# Altium project Power_vac.PrjPcb (part 1 of 2)
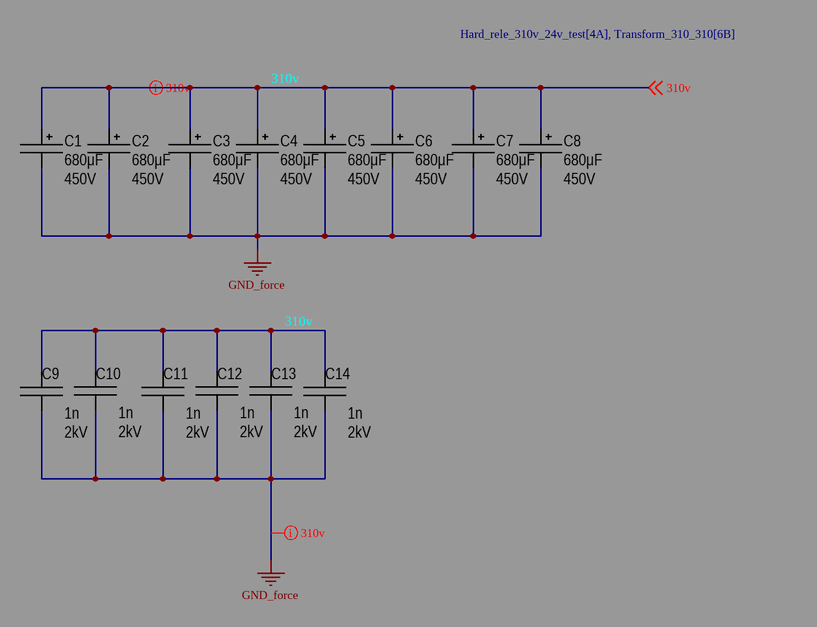
[diagram p0: Capasitors_vac.SchDoc]
9 sheets, 296 parts. Net scope: flat (ports and power ports of the same name join across sheets).
Board file: Power_vac.PcbDoc
Sheets:
  Capasitors_vac.SchDoc
  Hard_rele_310v_24v_test.SchDoc
  Cnnectors_power1.SchDoc
  Transform_12_310.SchDoc
  Transform_310_310.SchDoc
  Transform_310_3_24_24.SchDoc
  Detect_220.SchDoc
  Filtr_220.SchDoc
  Remove_from_CPU_to_Power.SchDoc

## Sheet Capasitors_vac.SchDoc
size A; SheetNumber: 1; SheetTotal: 9

### Parts
C1  value 680μF  Voltage: 450V  [CAP: D35C10H40]
C2  value 680μF  Voltage: 450V  [CAP: D35C10H40]
C3  value 680μF  Voltage: 450V  [CAP: D35C10H40]
C4  value 680μF  Voltage: 450V  [CAP: D35C10H40]
C5  value 680μF  Voltage: 450V  [CAP: D35C10H40]
C6  value 680μF  Voltage: 450V  [CAP: D35C10H40]
C7  value 680μF  Voltage: 450V  [CAP: D35C10H40]
C8  value 680μF  Voltage: 450V  [CAP: D35C10H40]
C9  value 1n  Voltage: 2kV  [CAP: AY2102M29Y5US63L7]
C10  value 1n  Voltage: 2kV  [CAP: AY2102M29Y5US63L7]
C11  value 1n  Voltage: 2kV  [CAP: AY2102M29Y5US63L7]
C12  value 1n  Voltage: 2kV  [CAP: AY2102M29Y5US63L7]
C13  value 1n  Voltage: 2kV  [CAP: AY2102M29Y5US63L7]
C14  value 1n  Voltage: 2kV  [CAP: AY2102M29Y5US63L7]

### Nets
GND_force: C1.2 C2.2 C3.2 C4.2 C5.2 C6.2 C7.2 C8.2 C9.2 C10.2 C11.2 C12.2 C13.2 C14.2
310v: C1.1 C2.1 C3.1 C4.1 C5.1 C6.1 C7.1 C8.1 C9.1 C10.1 C11.1 C12.1 C13.1 C14.1 ; off-sheet 310v

### Layout directives
net class 310v: 310v, GND_force

### Library data of the parts
C1-C8 = Aluminium: Manufacturer: Wurth; PartNumber: 860080475013; ValueManufacturerPartNumber: Aluminium capacitor, 680μF, 450V, ±20%, 54mOhm, 14x10x5 mm, -55...+105°C; TypeCapacitor: Aluminium capacitor; Tolerance: ±20%; Impedance: 54mOhm; Package: 14x10x5 mm; HelpURL: https://www.digikey.com/product-detail/en/wurth-electronics-inc/860080475013/732-9029-1-ND/5728972; Temperature: -55...+105°C
C9-C14 = Film: Manufacturer: Epcos; PartNumber: B32774D4106K000; ValueManufacturerPartNumber: Film capacitor, 1n, 2kV, ±10%, 10.9mOhm, 31.5x15 mm, -40...+105°C; TypeCapacitor: Film capacitor; Tolerance: ±10%; Impedance: 10.9mOhm; Package: 31.5x15 mm; HelpURL: https://www.digikey.com/products/en/capacitors/film-capacitors/62?k=&pkeyword=&sv=0&pv2097=1958&sf=0&FV=fffc01ef%2C1f140000%2Cffe0003e%2Cffec6366&quantity=1&ColumnSort=1000011&page=1&stock=1&pageSize=25; Temperature: -40...+105°C

## Sheet Hard_rele_310v_24v_test.SchDoc
size B; SheetNumber: 2; SheetTotal: 9
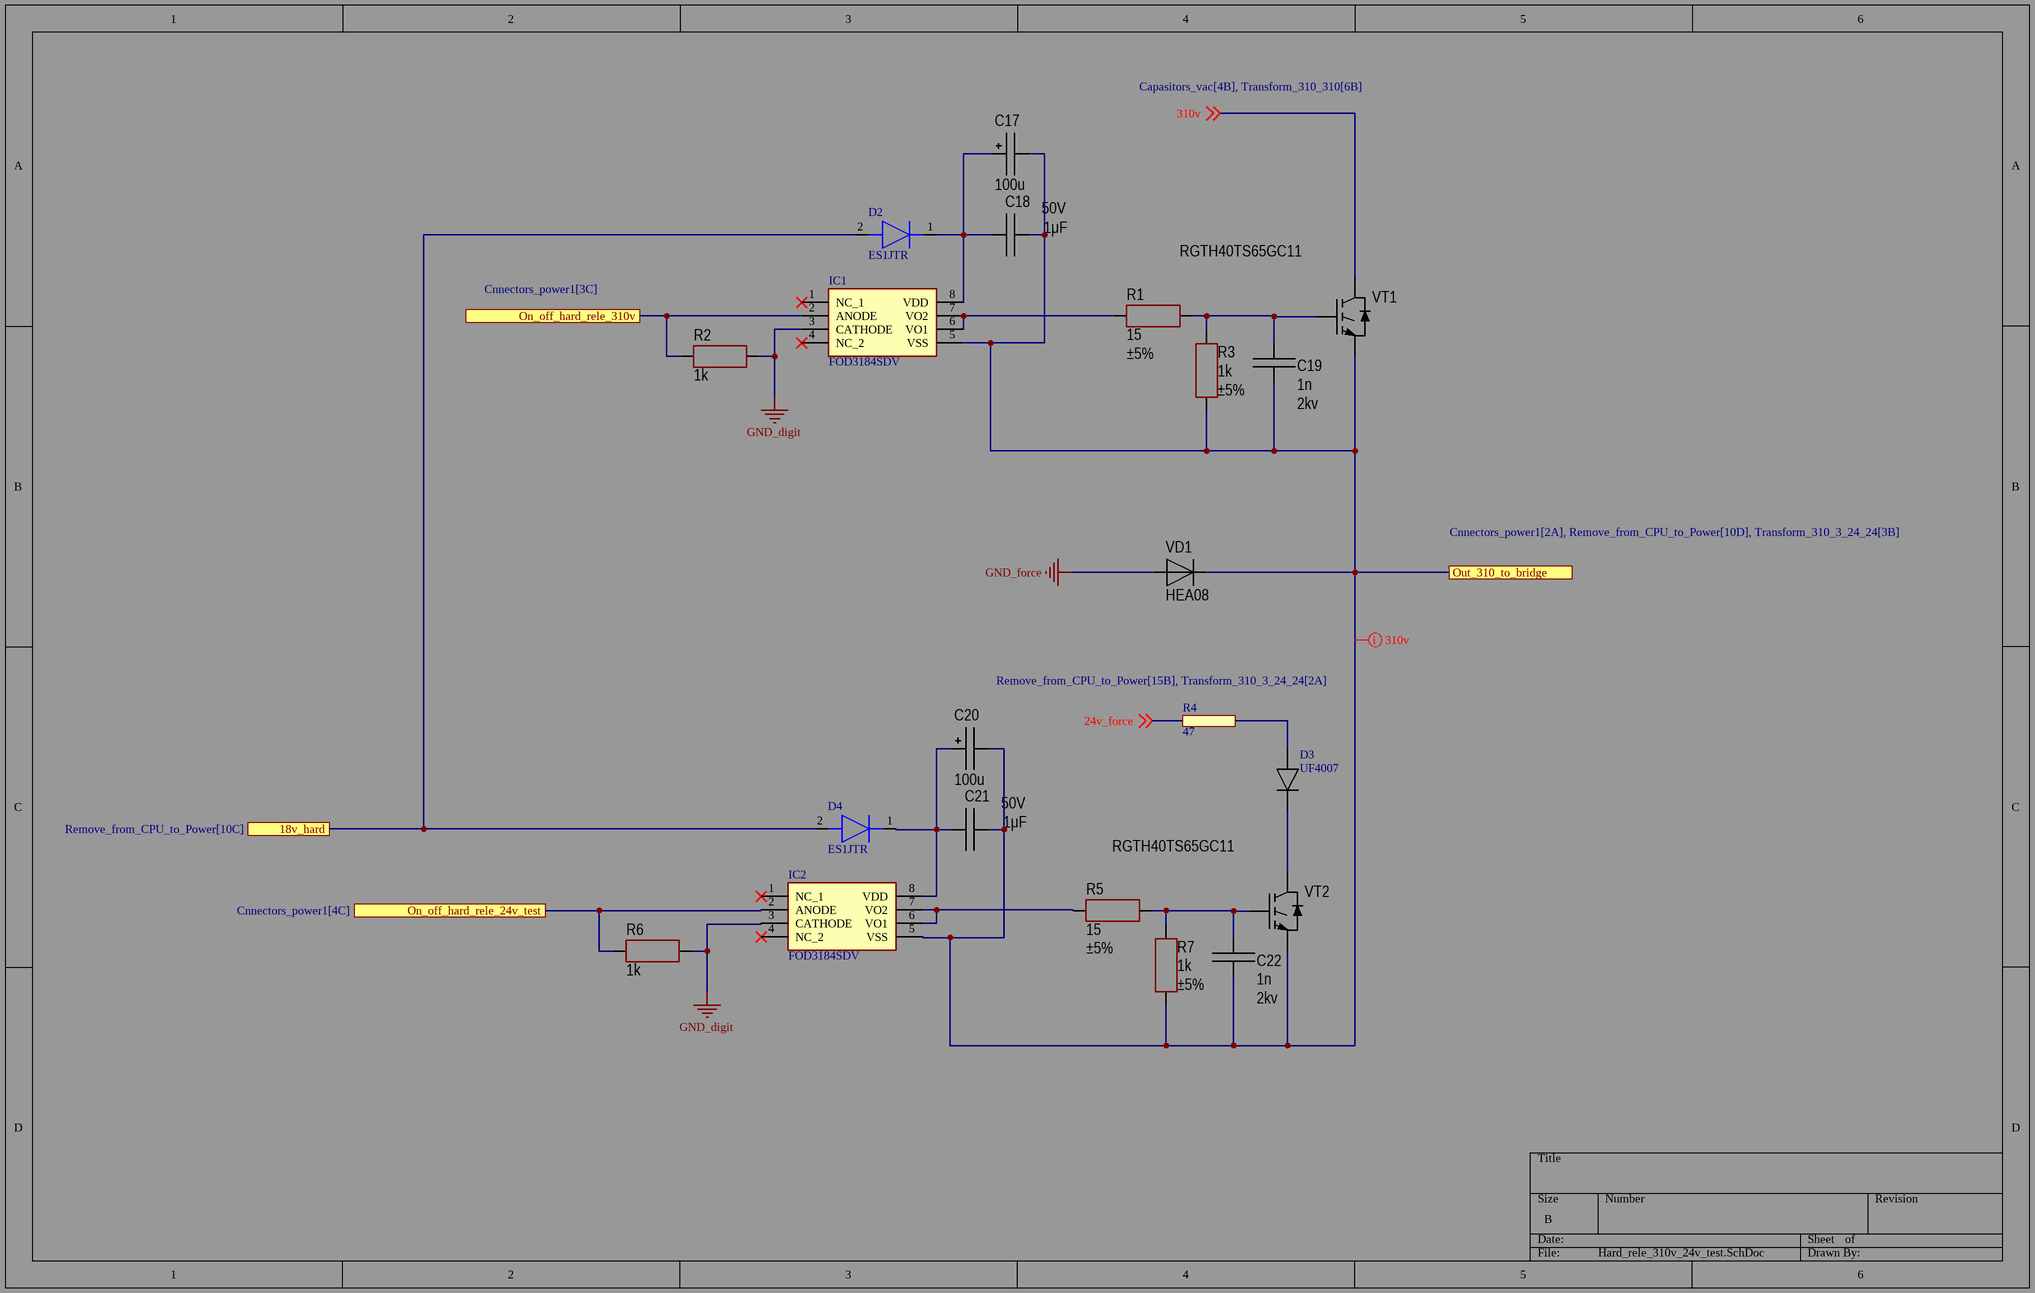
[diagram p1: Hard_rele_310v_24v_test.SchDoc]

### Parts
C17  value 100u  [CAP: D8C3.5H12]
C18  value 1μF  Voltage: 50V  [CAP: 1206]
C19  value 1n  Voltage: 2kv  [CAP: AY2102M29Y5US63L7]
C20  value 100u  [CAP: D8C3.5H12]
C21  value 1μF  Voltage: 50V  [CAP: 1206]
C22  value 1n  Voltage: 2kv  [CAP: AY2102M29Y5US63L7]
D2  ES1JTR  [DIOM5226X295N]
D3  UF4007  [THT_D_6mm_1]
D4  ES1JTR  [DIOM5226X295N]
IC1  FOD3184SDV  [SOP254P1030X508-8N]
IC2  FOD3184SDV  [SOP254P1030X508-8N]
R1  value 15  Tolerance: ±5%  [RES: 2512]
R2  value 1k  [RES: 1206]
R3  value 1k  Tolerance: ±5%  [RES: 2512]
R4  47  [THT_R_6mm_1]
R5  value 15  Tolerance: ±5%  [RES: 2512]
R6  value 1k  [RES: 1206]
R7  value 1k  Tolerance: ±5%  [RES: 2512]
VD1  PartNumber: HEA08  [TO247(D)]
VT1  PartNumber: RGTH40TS65GC11  [TO247]
VT2  PartNumber: RGTH40TS65GC11  [TO247]

### Ports
18v_hard (see Remove_from_CPU_to_Power[10C]), On_off_hard_rele_24v_test (see Cnnectors_power1[4C]), On_off_hard_rele_310v (see Cnnectors_power1[3C]), Out_310_to_bridge (see Cnnectors_power1[2A], Remove_from_CPU_to_Power[10D], Transform_310_3_24_24[3B])

### Nets
GND_digit: IC1.3(CATHODE) IC2.3(CATHODE) R2.1 R6.1
GND_force: VD1.1
18v_hard: D2.2(A) D4.2(A) ; port 18v_hard
24v_force: R4.1 ; off-sheet 24v_force
310v: VT1.2(C) ; off-sheet 310v
On_off_hard_rele_24v_test: IC2.2(ANODE) R6.2 ; port On_off_hard_rele_24v_test
On_off_hard_rele_310v: IC1.2(ANODE) R2.2 ; port On_off_hard_rele_310v
Out_310_to_bridge: C17.2 C18.1 C19.1 C20.2 C21.1 C22.1 IC1.5(VSS) IC2.5(VSS) R3.1 R7.1 VD1.2 VT1.3(E) VT2.3(E) ; port Out_310_to_bridge
NetC17_1: C17.1 C18.2 D2.1(K) IC1.8(VDD)
NetC19_2: C19.2 R1.1 R3.2 VT1.1(G)
NetC20_1: C20.1 C21.2 D4.1(K) IC2.8(VDD)
NetC22_2: C22.2 R5.1 R7.2 VT2.1(G)
NetD3_1: D3.1 R4.2
NetD3_2: D3.2 VT2.2(C)
NetIC1_6: IC1.6(VO1) IC1.7(VO2) R1.2
NetIC2_6: IC2.6(VO1) IC2.7(VO2) R5.2

Not connected (* = marked no-connect by the designer): IC1 1(NC_1)* 4(NC_2)*; IC2 1(NC_1)* 4(NC_2)*

### Layout directives
net class 310v: Out_310_to_bridge

### Library data of the parts
C17 C20 = Aluminium: Manufacturer: Wurth; PartNumber: 860080475013; ValueManufacturerPartNumber: Aluminium capacitor, 100u, 25V, ±20%, 54mOhm, 14x10x5 mm, -55...+105°C; TypeCapacitor: Aluminium capacitor; Tolerance: ±20%; Impedance: 54mOhm; Voltage: 25V; Package: 14x10x5 mm; HelpURL: https://www.digikey.com/product-detail/en/wurth-electronics-inc/860080475013/732-9029-1-ND/5728972; Temperature: -55...+105°C
C18 C21 = Ceramic_1206: Manufacturer: Yageo; PartNumber: CC1206KRX7R9BB104; ValueManufacturerPartNumber: Ceramic capacitor, 1μF, X7R, ±10%, 50V, 1206, -55...+125°C; TypeCapacitor: Ceramic capacitor; Tolerance: ±10%; TypeDielectric: X7R; Package: 1206; HelpURL: https://www.digikey.com/product-detail/en/yageo/CC1206KRX7R9BB104/311-1179-1-ND/303089; Temperature: -55...+125°C
C19 C22 = Film: Manufacturer: Epcos; PartNumber: B32774D4106K000; ValueManufacturerPartNumber: Film capacitor, 1n, 2kv, ±10%, 10.9mOhm, 31.5x15 mm, -40...+105°C; TypeCapacitor: Film capacitor; Tolerance: ±10%; Impedance: 10.9mOhm; Package: 31.5x15 mm; HelpURL: https://www.digikey.com/products/en/capacitors/film-capacitors/62?k=&pkeyword=&sv=0&pv2097=1958&sf=0&FV=fffc01ef%2C1f140000%2Cffe0003e%2Cffec6366&quantity=1&ColumnSort=1000011&page=1&stock=1&pageSize=25; Temperature: -40...+105°C
D2 D4 = ES1JTR: Diode; Manufacturer_Name: SMC Diode Solutions; Datasheet Link: http://www.smc-diodes.com/propdf/ES1(A-M)%20N0159%20REV.E.pdf; Height: 2.95mm; Manufacturer_Part_Number: ES1JTR
D3 = THT_D_6mm_1
IC1 IC2 = FOD3184SDV: Integrated Circuit; Manufacturer_Name: onsemi; Datasheet Link: https://www.arrow.com/en/products/fod3184sdv/on-semiconductor; Height: 5.08mm; Manufacturer_Part_Number: FOD3184SDV; Mouser Part Number: 512-FOD3184SDV; Mouser Price/Stock: https://www.mouser.co.uk/ProductDetail/onsemi-Fairchild/FOD3184SDV?qs=GCVmsggAYMRSO6%252BIR7fWEw%3D%3D; Arrow Part Number: FOD3184SDV; Arrow Price/Stock: https://www.arrow.com/en/products/fod3184sdv/on-semiconductor?region=nac
R1 R5 = Resistor_2512: Manufacturer: Yageo; PartNumber: RC2512JK-07100RL; ValueManufacturerPartNumber: Resistor film, 15, ±5%, 2512, 1W, -55...+125°C; TypeResistor: Resistor film; Power: 1W; Package: 2512; HelpURL: https://www.digikey.com/product-detail/en/yageo/RC2512JK-07100RL/YAG3393CT-ND/5962215; Temperature: -55...+125°C
R2 R6 = Resistor_1206: Manufacturer: Yageo; PartNumber: RC1206JR-07100RL; ValueManufacturerPartNumber: Resistor film, 1k, ±5%, 1206, 0.25W, -55...+125°C; TypeResistor: Resistor film; Power: 0.25W; Tolerance: ±5%; Package: 1206; HelpURL: https://www.digikey.com/product-detail/en/yageo/RC1206JR-07100RL/311-100ERCT-ND/732153; Temperature: -55...+125°C
R3 R7 = Resistor_2512: Manufacturer: Yageo; PartNumber: RC2512JK-07100RL; ValueManufacturerPartNumber: Resistor film, 1k, ±5%, 2512, 1W, -55...+125°C; TypeResistor: Resistor film; Power: 1W; Package: 2512; HelpURL: https://www.digikey.com/product-detail/en/yageo/RC2512JK-07100RL/YAG3393CT-ND/5962215; Temperature: -55...+125°C
R4 = THT_R_6mm_1
VD1 = Diode_single: Manufacturer: Micro Commercial; ValueManufacturerPartNumber: Single diode, 75V, 150mA, 1V, 4ns, SOD-323, -55...+150°C; TypeDiode: Single diode; Voltage: 75V; Current: 150mA; VoltageDrop: 1V; RecoveryTime: 4ns; Package: SOD-323; HelpURL: https://www.digikey.com/product-detail/en/micro-commercial-co/1N4148WX-TP/1N4148WXTPMSCT-ND/717312; Temperature: -55...+150°C
VT1 VT2 = IGBT: Manufacturer: Rohm Semiconductor; ValueManufacturerPartNumber: IGBT transistor, 650V, 40A, 40nC, 144W, 2.1V, 22ns/73ns, TO247, -55...+125°C; TypeTransistor: IGBT transistor; VoltageCE: 650V; CurrentCE: 40A; VoltageSaturation: 2.1V; GateCharge: 40nC; TimeOnOff: 22ns/73ns; MaxPower: 144W; Package: TO247; HelpURL: https://www.digikey.com/product-detail/en/rohm-semiconductor/RGTH40TS65GC11/RGTH40TS65GC11-ND/5029953; Temperature: -55...+125°C

## Sheet Cnnectors_power1.SchDoc
size C; SheetNumber: 3; SheetTotal: 9
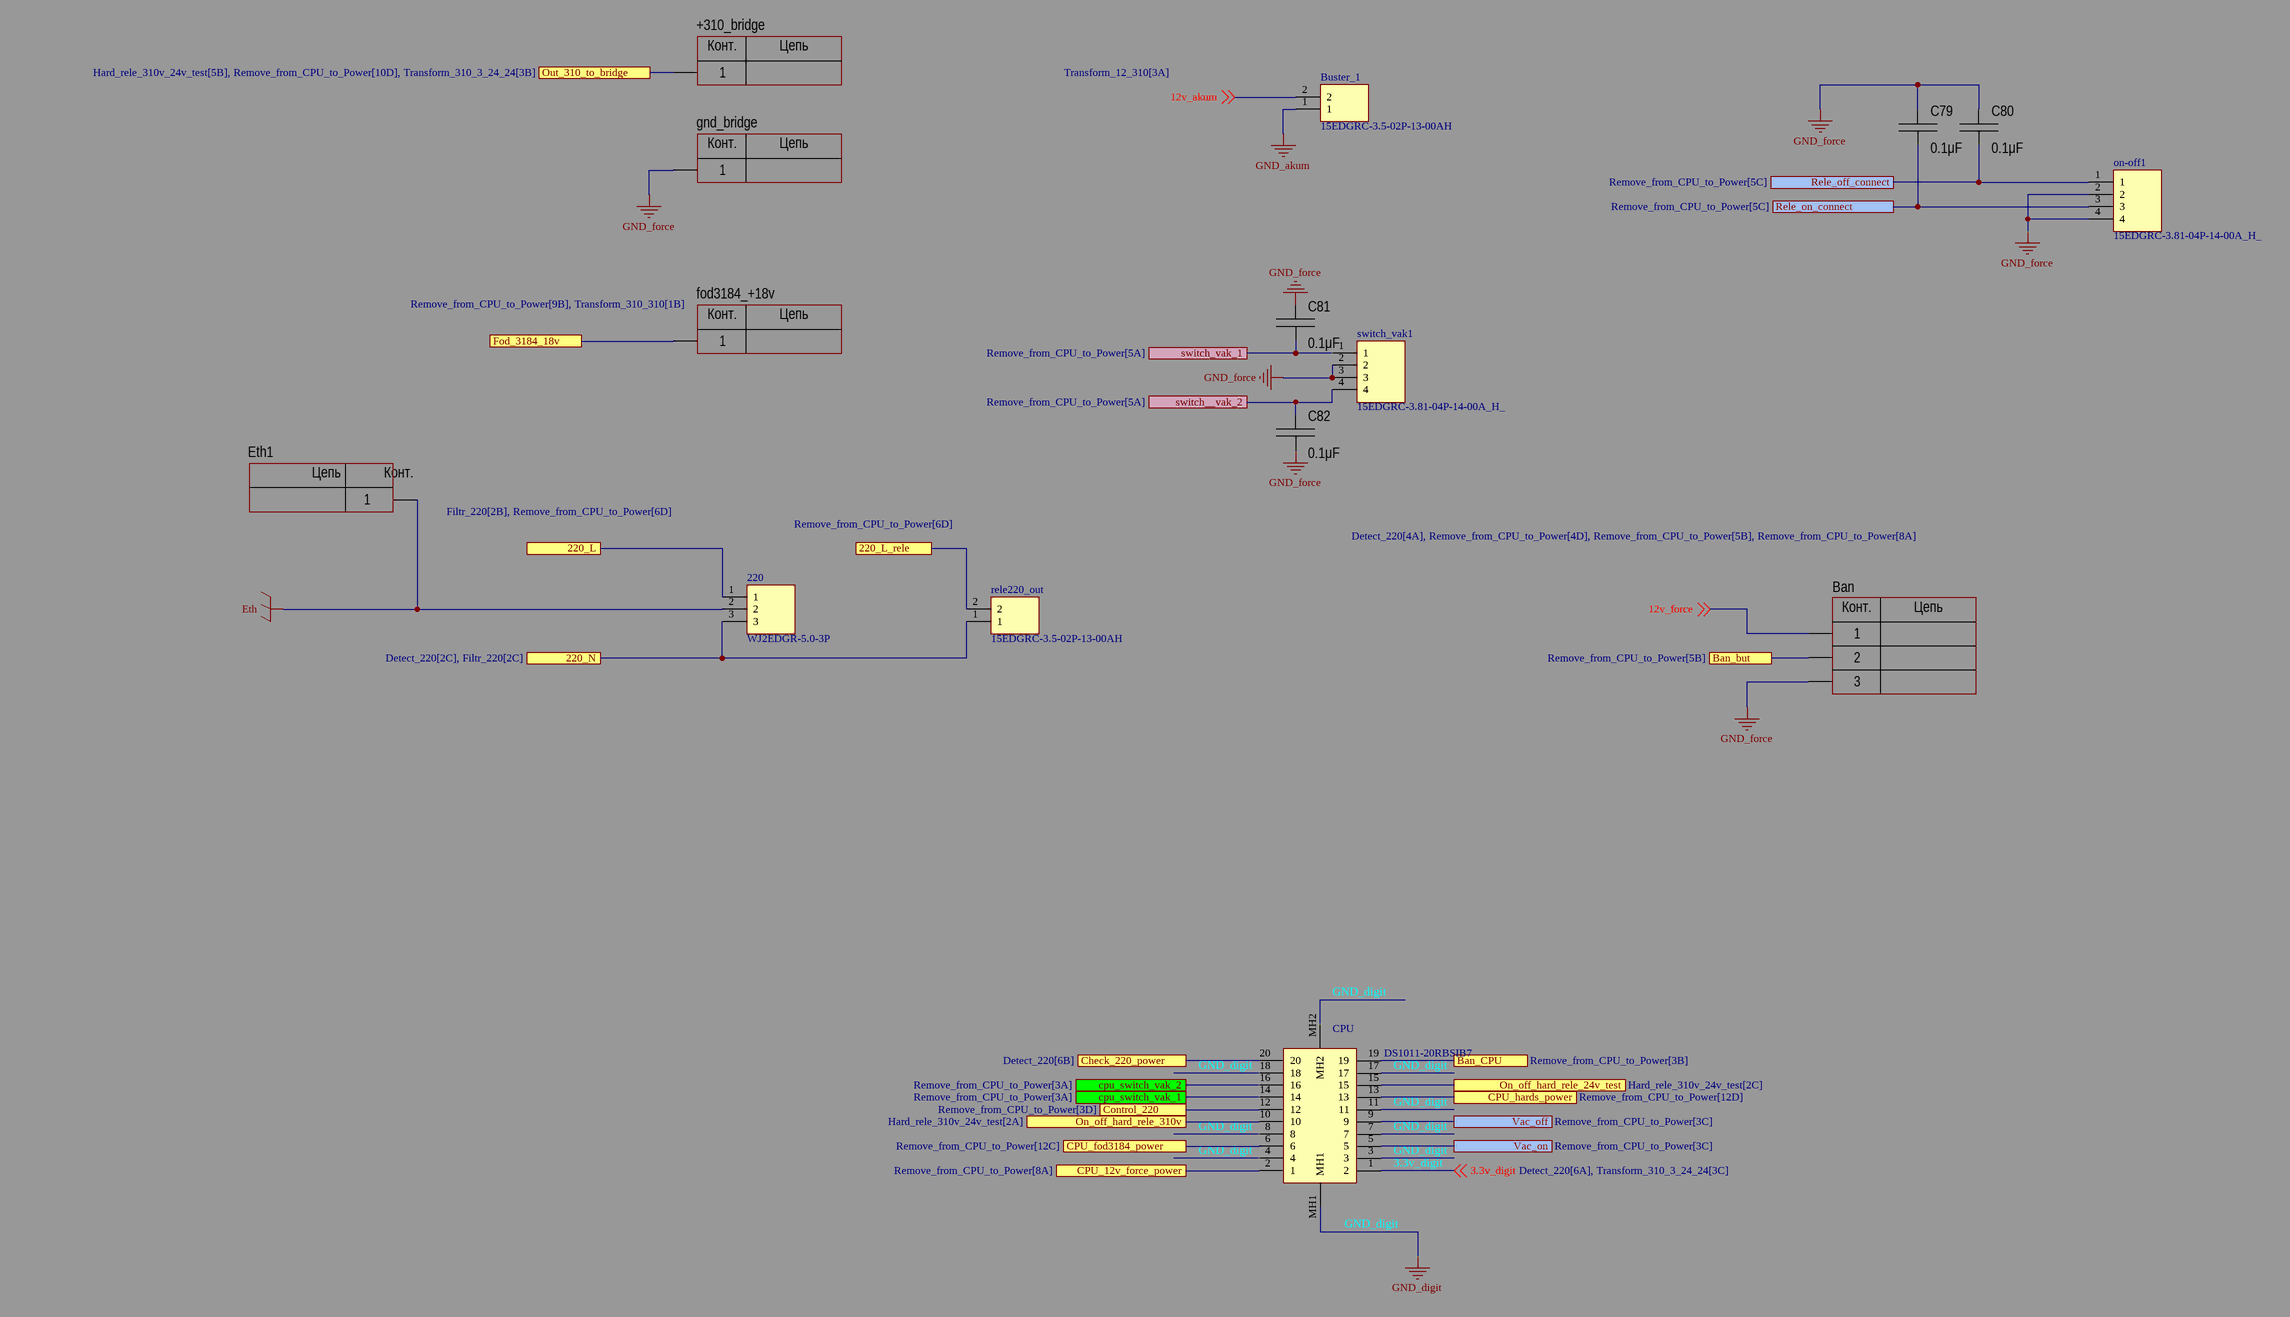
[diagram p2: Cnnectors_power1.SchDoc]

### Parts
220  WJ2EDGR-5.0-3P  [WJ2EDGR503P]
+310_bridge  (no value)  [CON: TH 3.5mm]
Ban  (no value)  [CON: 15EDGVC-3.5-03 (or 691321100003)]
Buster_1  15EDGRC-3.5-02P-13-00AH  [15EDGRC3502P1300AH]
C79  value 0.1μF  [CAP: 1206]
C80  value 0.1μF  [CAP: 1206]
C81  value 0.1μF  [CAP: 1206]
C82  value 0.1μF  [CAP: 1206]
CPU  DS1011-20RBSIB7  [DS101120RBSIB7]
Eth1  (no value)  [CON: TH 3.5mm]
fod3184_+18v  (no value)  [CON: TH 1mm]
gnd_bridge  (no value)  [CON: TH 3.5mm]
on-off1  15EDGRC-3.81-04P-14-00A_H_  [SHDRRA4W80P0X381_1X4_1603X920X754P]
rele220_out  15EDGRC-3.5-02P-13-00AH  [15EDGRC3502P1300AH]
switch_vak1  15EDGRC-3.81-04P-14-00A_H_  [SHDRRA4W80P0X381_1X4_1603X920X754P]

### Ports
220_L (see Filtr_220[2B], Remove_from_CPU_to_Power[6D]), 220_L_rele (see Remove_from_CPU_to_Power[6D]), 220_N (see Detect_220[2C], Filtr_220[2C]), Ban_but (see Remove_from_CPU_to_Power[5B]), Ban_CPU (see Remove_from_CPU_to_Power[3B]), Check_220_power (see Detect_220[6B]), Control_220 (see Remove_from_CPU_to_Power[3D]), CPU_12v_force_power (see Remove_from_CPU_to_Power[8A]), CPU_fod3184_power (see Remove_from_CPU_to_Power[12C]), CPU_hards_power (see Remove_from_CPU_to_Power[12D]), cpu_switch_vak_1 (see Remove_from_CPU_to_Power[3A]), cpu_switch_vak_2 (see Remove_from_CPU_to_Power[3A]), Fod_3184_18v (see Remove_from_CPU_to_Power[9B], Transform_310_310[1B]), On_off_hard_rele_24v_test (see Hard_rele_310v_24v_test[2C]), On_off_hard_rele_310v (see Hard_rele_310v_24v_test[2A]), Out_310_to_bridge (see Hard_rele_310v_24v_test[5B], Remove_from_CPU_to_Power[10D], Transform_310_3_24_24[3B]), Rele_off_connect (see Remove_from_CPU_to_Power[5C]), Rele_on_connect (see Remove_from_CPU_to_Power[5C]), switch__vak_2 (see Remove_from_CPU_to_Power[5A]), switch_vak_1 (see Remove_from_CPU_to_Power[5A]), Vac_off (see Remove_from_CPU_to_Power[3C]), Vac_on (see Remove_from_CPU_to_Power[3C])

### Nets
Eth: 220.2 Eth1.1
GND_akum: Buster_1.1
GND_digit: CPU.3 CPU.4 CPU.7 CPU.8 CPU.11 CPU.17 CPU.18 CPU.MH1 CPU.MH2
GND_force: Ban.3 C79.1 C80.1 C81.1 C82.2 gnd_bridge.1 on-off1.2 on-off1.4 switch_vak1.2 switch_vak1.3
3.3v_digit: CPU.1(2) ; off-sheet 3.3v_digit
12v_akum: Buster_1.2 ; off-sheet 12v_akum
12v_force: Ban.1 ; off-sheet 12v_force
220_L: 220.1 ; port 220_L
220_L_rele: rele220_out.2 ; port 220_L_rele
220_N: 220.3 rele220_out.1 ; port 220_N
Ban_but: Ban.2 ; port Ban_but
Ban_CPU: CPU.19 ; port Ban_CPU
Check_220_power: CPU.20 ; port Check_220_power
Control_220: CPU.12 ; port Control_220
CPU_12v_force_power: CPU.2(1) ; port CPU_12v_force_power
CPU_fod3184_power: CPU.6 ; port CPU_fod3184_power
CPU_hards_power: CPU.13 ; port CPU_hards_power
cpu_switch_vak_1: CPU.14 ; port cpu_switch_vak_1
cpu_switch_vak_2: CPU.16 ; port cpu_switch_vak_2
Fod_3184_18v: fod3184_+18v.1 ; port Fod_3184_18v
On_off_hard_rele_24v_test: CPU.15 ; port On_off_hard_rele_24v_test
On_off_hard_rele_310v: CPU.10 ; port On_off_hard_rele_310v
Out_310_to_bridge: +310_bridge.1 ; port Out_310_to_bridge
Rele_off_connect: C80.2 on-off1.1 ; port Rele_off_connect
Rele_on_connect: C79.2 on-off1.3 ; port Rele_on_connect
switch__vak_2: C82.1 switch_vak1.4 ; port switch__vak_2
switch_vak_1: C81.2 switch_vak1.1 ; port switch_vak_1
Vac_off: CPU.9 ; port Vac_off
Vac_on: CPU.5 ; port Vac_on

### Notes on the sheet
- (in symbol Connector_single_power) Цепь; Конт.
- (in symbol Connector_terminal_3pin) Конт.; Цепь

### Library data of the parts
220 = WJ2EDGR-5.0-3P: Connector; Manufacturer_Name: Ningbo Kangnex; Datasheet Link: https://datasheet.lcsc.com/lcsc/1912251636_Ningbo-Kangnex-Elec-WJ2EDGR-5-0-3P_C8480.pdf; Height: 8.4mm; Manufacturer_Part_Number: WJ2EDGR-5.0-3P
+310_bridge Eth1 fod3184_+18v gnd_bridge = Connector_single_power: ValueManufacturerPartNumber: Power connector, *, *; TypeConnector: Power connector; CommentText: "Разъем"; Manufacturer: *; HelpURL: *; PartNumber: *; VoltageMax: *; CurrentMax: *
Ban = Connector_terminal_3pin: Manufacturer: Degson; ValueManufacturerPartNumber: Terminal connector, 3pin, 3.5mm, 300VAC, 10A; PartNumber: DG350-3.5-03P-14; TypeConnector: Terminal connector; VoltageMax: 300VAC; Pitch: 3.5mm; CurrentMax: 10A; Multichannel: 3pin; CommentText: "Разъем"; HelpURL: https://www.chipdip.ru/product/dg350-3.5-03p-12
Buster_1 rele220_out = 15EDGRC-3.5-02P-13-00AH: Connector; Manufacturer_Name: Degson; Datasheet Link: https://www.tme.eu/Document/c7e2facf434c6541c93efde757aaf5e6/607.pdf; Height: 7mm; Manufacturer_Part_Number: 15EDGRC-3.5-02P-13-00AH
C79-C82 = Ceramic_1206: Manufacturer: Yageo; PartNumber: CC1206KRX7R9BB104; ValueManufacturerPartNumber: Ceramic capacitor, 0.1μF, X7R, ±10%, 50V, 1206, -55...+125°C; TypeCapacitor: Ceramic capacitor; Tolerance: ±10%; TypeDielectric: X7R; Voltage: 50V; Package: 1206; HelpURL: https://www.digikey.com/product-detail/en/yageo/CC1206KRX7R9BB104/311-1179-1-ND/303089; Temperature: -55...+125°C
CPU = DS1011-20RBSIB7: Connector; Manufacturer_Name: Connfly; Datasheet Link: https://www.tme.com/Document/a911e76bcf9b13f23ffda9abd299f5e3/DS1011.pdf; Height: 8.7mm; Manufacturer_Part_Number: DS1011-20RBSIB7
on-off1 switch_vak1 = 15EDGRC-3.81-04P-14-00A_H_: Connector; Manufacturer_Name: Degson; Manufacturer_Part_Number: 15EDGRC-3.81-04P-14-00A(H); Datasheet Link: https://datasheet.octopart.com/15EDGRC-3.81-04P-14-00A%28H%29-Degson-datasheet-17801160.pdf; Height: 7.54mm

## Sheet Transform_12_310.SchDoc
size C; SheetNumber: 4; SheetTotal: 9
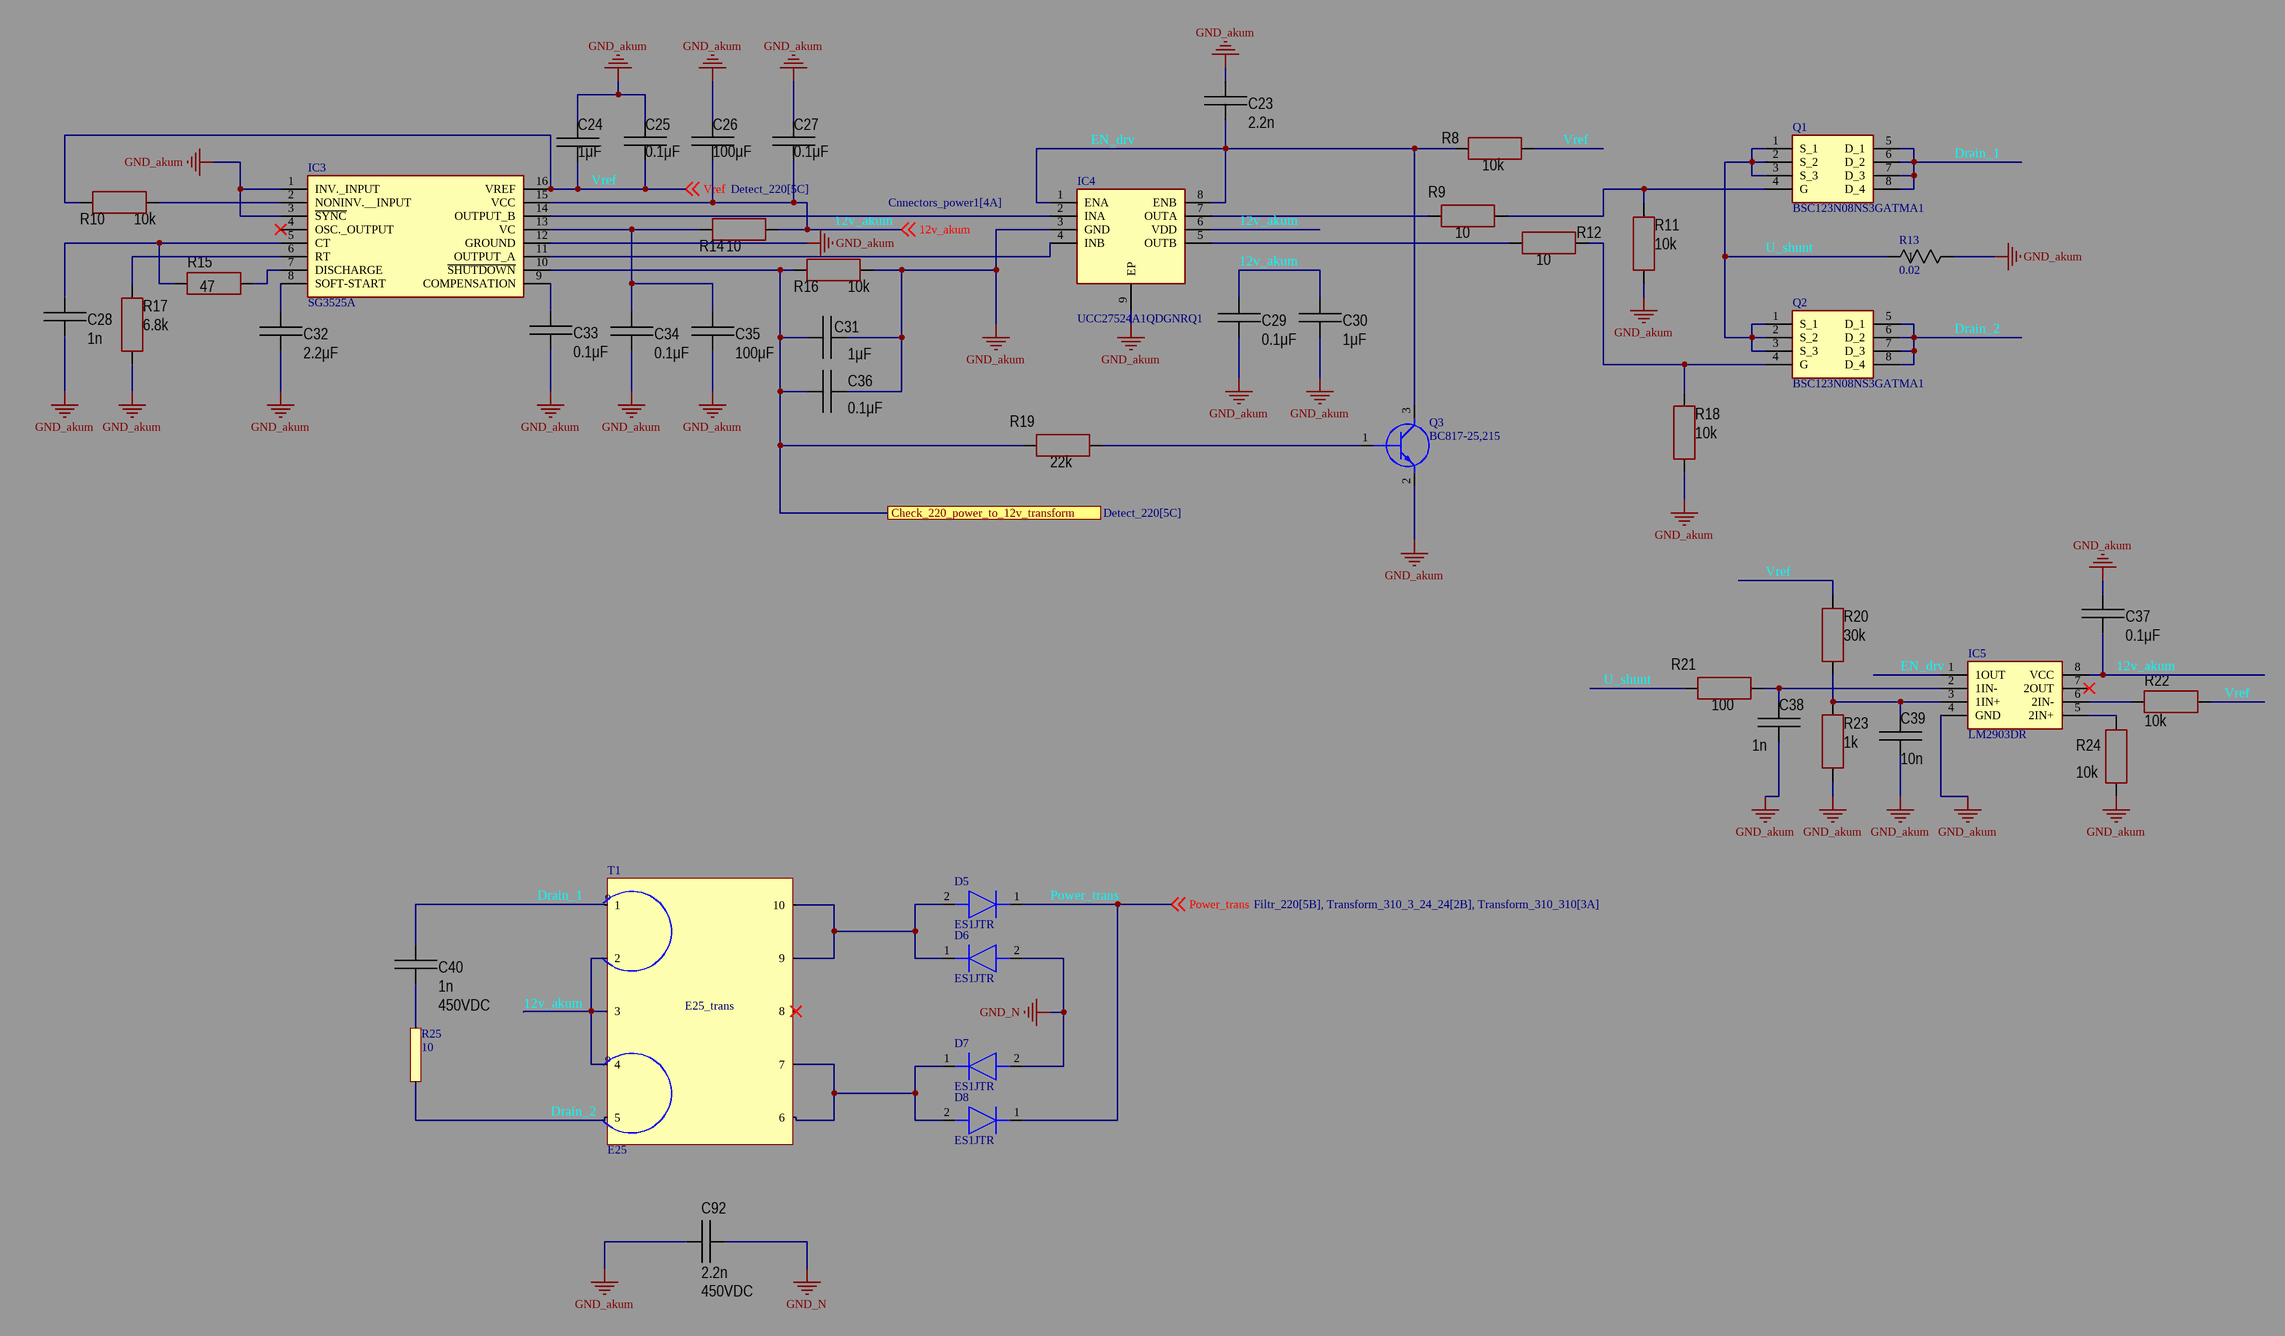
[diagram p3: Transform_12_310.SchDoc]

### Parts
C23  value 2.2n  [CAP: 1206]
C24  value 1μF  [CAP: 1206]
C25  value 0.1μF  [CAP: 1206]
C26  value 100μF  [CAP: 1206]
C27  value 0.1μF  [CAP: 1206]
C28  value 1n  [CAP: 1206]
C29  value 0.1μF  [CAP: 1206]
C30  value 1μF  [CAP: 1206]
C31  value 1μF  [CAP: 1206]
C32  value 2.2μF  [CAP: 1206]
C33  value 0.1μF  [CAP: 1206]
C34  value 0.1μF  [CAP: 1206]
C35  value 100μF  [CAP: 1206]
C36  value 0.1μF  [CAP: 1206]
C37  value 0.1μF  [CAP: 1206]
C38  value 1n  [CAP: 1206]
C39  value 10n  [CAP: 1206]
C40  value 1n  Voltage: 450VDC  [CAP: AY2102M29Y5US63L7]
C92  value 2.2n  Voltage: 450VDC  [CAP: AY2102M29Y5US63L7]
D5  ES1JTR  [DIOM5226X295N]
D6  ES1JTR  [DIOM5226X295N]
D7  ES1JTR  [DIOM5226X295N]
D8  ES1JTR  [DIOM5226X295N]
IC3  SG3525A  [SOIC127P1030X265-16N]
IC4  UCC27524A1QDGNRQ1  [SOP65P490X110-9N]
IC5  LM2903DR  [SOIC127P600X175-8N]
Q1  BSC123N08NS3GATMA1  [PG-TDSON-8]
Q2  BSC123N08NS3GATMA1  [PG-TDSON-8]
Q3  BC817-25,215  [BC81725215]
R8  value 10k  [RES: 1206]
R9  value 10  [RES: 1206]
R10  value 10k  [RES: 1206]
R11  value 10k  [RES: 1206]
R12  value 10  [RES: 1206]
R13  0.02  [RES_BPR58-STRAIGHT_KOA]
R14  value 10  [RES: 1206]
R15  value 47  [RES: 1206]
R16  value 10k  [RES: 1206]
R17  value 6.8k  [RES: 1206]
R18  value 10k  [RES: 1206]
R19  value 22k  [RES: 1206]
R20  value 30k  [RES: 1206]
R21  value 100  [RES: 1206]
R22  value 10k  [RES: 1206]
R23  value 1k  [RES: 1206]
R24  value 10k  [RES: 1206]
R25  10  [THT_R_6mm_1]
T1  E25  [E25]

### Ports
Check_220_power_to_12v_transform (see Detect_220[5C])

### Nets
GND_akum: C23.2 C24.1 C25.2 C26.2 C27.2 C28.1 C29.2 C30.2 C31.1 C32.2 C33.2 C34.2 C35.2 C36.1 C37.2 C38.2 C39.2 C92.1 IC3.1(INV._INPUT) IC3.3(~{SYNC}) IC3.12(GROUND) IC4.3(GND) IC4.9(EP) IC5.4(GND) Q3.2(E) R11.1 R13.2 R16.2 R17.1 R18.1 R23.1 R24.1
GND_N: C92.2 D6.2(A) D7.2(A)
12v_akum: C26.1 C27.1 C29.1 C30.1 C37.1 IC3.15(VCC) IC4.6(VDD) IC5.8(VCC) R14.2 T1.2 T1.3 T1.4 ; off-sheet 12v_akum
Check_220_power_to_12v_transform: C31.2 C36.2 IC3.10(~{SHUTDOWN}) R16.1 R19.1 ; port Check_220_power_to_12v_transform
Drain_1: C40.1 Q1.5(D_1) Q1.6(D_2) Q1.7(D_3) Q1.8(D_4) T1.1
Drain_2: Q2.5(D_1) Q2.6(D_2) Q2.7(D_3) Q2.8(D_4) R25.1 T1.5
EN_drv: C23.1 IC4.1(ENA) IC4.8(ENB) IC5.1(1OUT) Q3.3(C) R8.1
Power_trans: D5.1(K) D8.1(K) ; off-sheet Power_trans
U_shunt: Q1.1(S_1) Q1.2(S_2) Q1.3(S_3) Q2.1(S_1) Q2.2(S_2) Q2.3(S_3) R13.1 R21.1
Vref: C24.2 C25.1 IC3.16(VREF) R8.2 R10.1 R20.2 R22.1 ; off-sheet Vref
NetC28_2: C28.2 IC3.5(CT) R15.2
NetC32_1: C32.1 IC3.8(SOFT-START)
NetC33_1: C33.1 IC3.9(COMPENSATION)
NetC34_1: C34.1 C35.1 IC3.13(VC) R14.1
NetC38_1: C38.1 IC5.2(1IN-) R21.2
NetC39_1: C39.1 IC5.3(1IN+) R20.1 R23.2
NetC40_2: C40.2 R25.2
NetD5_2: D5.2(A) D6.1(K) T1.9 T1.10
NetD7_1: D7.1(K) D8.2(A) T1.6 T1.7
NetIC3_2: IC3.2(NONINV.__INPUT) R10.2
NetIC3_6: IC3.6(RT) R17.2
NetIC3_7: IC3.7(DISCHARGE) R15.1
NetIC3_11: IC3.11(OUTPUT_A) IC4.4(INB)
NetIC3_14: IC3.14(OUTPUT_B) IC4.2(INA)
NetIC4_5: IC4.5(OUTB) R12.1
NetIC4_7: IC4.7(OUTA) R9.1
NetIC5_5: IC5.5(2IN+) R24.2
NetIC5_6: IC5.6(2IN-) R22.2
NetQ1_4: Q1.4(G) R9.2 R11.2
NetQ2_4: Q2.4(G) R12.2 R18.2
NetQ3_1: Q3.1(B) R19.2

Not connected (* = marked no-connect by the designer): IC3 4(OSC._OUTPUT)*; IC5 7(2OUT)*; T1 8*

### Notes on the sheet
- (near T1) o
- (in symbol E25) E25_trans

### Library data of the parts
C23 = Ceramic_1206: Manufacturer: Yageo; PartNumber: CC1206KRX7R9BB104; ValueManufacturerPartNumber: Ceramic capacitor, 2.2n, X7R, ±10%, 50V, 1206, -55...+125°C; TypeCapacitor: Ceramic capacitor; Tolerance: ±10%; TypeDielectric: X7R; Voltage: 50V; Package: 1206; HelpURL: https://www.digikey.com/product-detail/en/yageo/CC1206KRX7R9BB104/311-1179-1-ND/303089; Temperature: -55...+125°C
C24 C30 C31 = Ceramic_1206: Manufacturer: Yageo; PartNumber: CC1206KRX7R9BB104; ValueManufacturerPartNumber: Ceramic capacitor, 1μF, X7R, ±10%, 50V, 1206, -55...+125°C; TypeCapacitor: Ceramic capacitor; Tolerance: ±10%; TypeDielectric: X7R; Voltage: 50V; Package: 1206; HelpURL: https://www.digikey.com/product-detail/en/yageo/CC1206KRX7R9BB104/311-1179-1-ND/303089; Temperature: -55...+125°C
C25 C27 C29 C33 C34 C36 C37 = Ceramic_1206: as C79 on sheet Cnnectors_power1; Package: 1206; HelpURL: https://www.digikey.com/product-detail/en/yageo/CC1206KRX7R9BB104/311-1179-1-ND/303089; Temperature: -55...+125°C
C26 C35 = Ceramic_1206: Manufacturer: Yageo; PartNumber: CC1206KRX7R9BB104; ValueManufacturerPartNumber: Ceramic capacitor, 100μF, X7R, ±10%, 50V, 1206, -55...+125°C; TypeCapacitor: Ceramic capacitor; Tolerance: ±10%; TypeDielectric: X7R; Voltage: 50V; Package: 1206; HelpURL: https://www.digikey.com/product-detail/en/yageo/CC1206KRX7R9BB104/311-1179-1-ND/303089; Temperature: -55...+125°C
C28 C38 = Ceramic_1206: Manufacturer: Yageo; PartNumber: CC1206KRX7R9BB104; ValueManufacturerPartNumber: Ceramic capacitor, 1n, X7R, ±10%, 50V, 1206, -55...+125°C; TypeCapacitor: Ceramic capacitor; Tolerance: ±10%; TypeDielectric: X7R; Voltage: 50V; Package: 1206; HelpURL: https://www.digikey.com/product-detail/en/yageo/CC1206KRX7R9BB104/311-1179-1-ND/303089; Temperature: -55...+125°C
C32 = Ceramic_1206: Manufacturer: Yageo; PartNumber: CC1206KRX7R9BB104; ValueManufacturerPartNumber: Ceramic capacitor, 2.2μF, X7R, ±10%, 50V, 1206, -55...+125°C; TypeCapacitor: Ceramic capacitor; Tolerance: ±10%; TypeDielectric: X7R; Voltage: 50V; Package: 1206; HelpURL: https://www.digikey.com/product-detail/en/yageo/CC1206KRX7R9BB104/311-1179-1-ND/303089; Temperature: -55...+125°C
C39 = Ceramic_1206: Manufacturer: Yageo; PartNumber: CC1206KRX7R9BB104; ValueManufacturerPartNumber: Ceramic capacitor, 10n, X7R, ±10%, 50V, 1206, -55...+125°C; TypeCapacitor: Ceramic capacitor; Tolerance: ±10%; TypeDielectric: X7R; Voltage: 50V; Package: 1206; HelpURL: https://www.digikey.com/product-detail/en/yageo/CC1206KRX7R9BB104/311-1179-1-ND/303089; Temperature: -55...+125°C
C40 = Film: Manufacturer: Epcos; PartNumber: B32774D4106K000; ValueManufacturerPartNumber: Film capacitor, 1n, 450VDC, ±10%, 10.9mOhm, 31.5x15 mm, -40...+105°C; TypeCapacitor: Film capacitor; Tolerance: ±10%; Impedance: 10.9mOhm; Package: 31.5x15 mm; HelpURL: https://www.digikey.com/products/en/capacitors/film-capacitors/62?k=&pkeyword=&sv=0&pv2097=1958&sf=0&FV=fffc01ef%2C1f140000%2Cffe0003e%2Cffec6366&quantity=1&ColumnSort=1000011&page=1&stock=1&pageSize=25; Temperature: -40...+105°C
C92 = Film: Manufacturer: Epcos; PartNumber: B32774D4106K000; ValueManufacturerPartNumber: Film capacitor, 2.2n, 450VDC, ±10%, 10.9mOhm, 31.5x15 mm, -40...+105°C; TypeCapacitor: Film capacitor; Tolerance: ±10%; Impedance: 10.9mOhm; Package: 31.5x15 mm; HelpURL: https://www.digikey.com/products/en/capacitors/film-capacitors/62?k=&pkeyword=&sv=0&pv2097=1958&sf=0&FV=fffc01ef%2C1f140000%2Cffe0003e%2Cffec6366&quantity=1&ColumnSort=1000011&page=1&stock=1&pageSize=25; Temperature: -40...+105°C
D5-D8 = ES1JTR: as D2 on sheet Hard_rele_310v_24v_test; Datasheet Link: http://www.smc-diodes.com/propdf/ES1(A-M)%20N0159%20REV.E.pdf; Height: 2.95mm; Manufacturer_Part_Number: ES1JTR
IC3 = SG3525A: Integrated Circuit; Manufacturer_Name: onsemi; Datasheet Link: https://www.onsemi.com/pub/Collateral/SG3525A-D.PDF; Height: 2.65mm; Manufacturer_Part_Number: SG3525A; Mouser Part Number: N/A; Mouser Price/Stock: https://www.mouser.co.uk/ProductDetail/onsemi/SG3525A?qs=%252BEew9%252B0nqrDSSy3t2TCw8g%3D%3D
IC4 = UCC27524A1QDGNRQ1: Integrated Circuit; Manufacturer_Name: Texas Instruments; Datasheet Link: http://www.ti.com/lit/gpn/ucc27524a1-q1; Height: 1.1mm; Manufacturer_Part_Number: UCC27524A1QDGNRQ1; Mouser Part Number: 595-CC27524A1QDGNRQ1; Mouser Price/Stock: https://www.mouser.co.uk/ProductDetail/Texas-Instruments/UCC27524A1QDGNRQ1?qs=5aG0NVq1C4zKCNInVyVkfw%3D%3D; Arrow Part Number: UCC27524A1QDGNRQ1; Arrow Price/Stock: https://www.arrow.com/en/products/ucc27524a1qdgnrq1/texas-instruments.html?utm_currency=USD&region=nac
IC5 = LM2903DR: Integrated Circuit; Manufacturer_Name: Texas Instruments; Datasheet Link: http://www.ti.com/lit/ds/symlink/lm393.pdf; Height: 1.75mm; Manufacturer_Part_Number: LM2903DR; Mouser Part Number: 595-LM2903DR; Mouser Price/Stock: https://www.mouser.co.uk/ProductDetail/Texas-Instruments/LM2903DR?qs=6aLkNDRfRUZTZwd6enMTiA%3D%3D; Arrow Part Number: LM2903DR; Arrow Price/Stock: https://www.arrow.com/en/products/lm2903dr/texas-instruments?region=nac
Q1 Q2 = BSC123N08NS3GATMA1: MOSFET (N-Channel); Manufacturer_Name: Infineon; Datasheet Link: https://www.infineon.com/dgdl/Infineon-BSC123N08NS3G-DS-v02_05-en.pdf?fileId=db3a30431add1d95011ae80eb8555625; Manufacturer_Part_Number: BSC123N08NS3GATMA1; Mouser Part Number: 726-BSC123N08NS3GATM; Mouser Price/Stock: https://www.mouser.co.uk/ProductDetail/Infineon-Technologies/BSC123N08NS3GATMA1?qs=K00xGehIljtQ0xUH5qROpA%3D%3D; Arrow Part Number: BSC123N08NS3GATMA1; Arrow Price/Stock: https://www.arrow.com/en/products/bsc123n08ns3gatma1/infineon-technologies-ag.html?utm_currency=USD&region=asia
Q3 = BC817-25,215: Transistor BJT NPN; Manufacturer_Name: Nexperia; Datasheet Link: https://assets.nexperia.com/documents/data-sheet/BC817_SER.pdf; Height: 1.1mm; Manufacturer_Part_Number: BC817-25,215; Mouser Part Number: 771-BC817-25-T/R; Mouser Price/Stock: https://www.mouser.co.uk/ProductDetail/Nexperia/BC817-25215?qs=me8TqzrmIYUj67JkTBzlfg%3D%3D; Arrow Part Number: BC817-25,215; Arrow Price/Stock: https://www.arrow.com/en/products/bc817-25215/nexperia?region=nac
R8 R10 R11 R16 R18 R22 R24 = Resistor_1206: Manufacturer: Yageo; PartNumber: RC1206JR-07100RL; ValueManufacturerPartNumber: Resistor film, 10k, ±5%, 1206, 0.25W, -55...+125°C; TypeResistor: Resistor film; Power: 0.25W; Tolerance: ±5%; Package: 1206; HelpURL: https://www.digikey.com/product-detail/en/yageo/RC1206JR-07100RL/311-100ERCT-ND/732153; Temperature: -55...+125°C; Parameter 1: *
R9 R12 R14 = Resistor_1206: Manufacturer: Yageo; PartNumber: RC1206JR-07100RL; ValueManufacturerPartNumber: Resistor film, 10, ±5%, 1206, 0.25W, -55...+125°C; TypeResistor: Resistor film; Power: 0.25W; Tolerance: ±5%; Package: 1206; HelpURL: https://www.digikey.com/product-detail/en/yageo/RC1206JR-07100RL/311-100ERCT-ND/732153; Temperature: -55...+125°C; Parameter 1: *
R13 = BPR58CR10J: No Description Available; Manufacturer_Name: KOA Speer; Type: Through Hole Resistors; Copyright: Copyright (C) 2026 Ultra Librarian. All rights reserved.; Manufacturer_Part_Number: BPR58CR10J
R15 = Resistor_1206: Manufacturer: Yageo; PartNumber: RC1206JR-07100RL; ValueManufacturerPartNumber: Resistor film, 47, ±5%, 1206, 0.25W, -55...+125°C; TypeResistor: Resistor film; Power: 0.25W; Tolerance: ±5%; Package: 1206; HelpURL: https://www.digikey.com/product-detail/en/yageo/RC1206JR-07100RL/311-100ERCT-ND/732153; Temperature: -55...+125°C; Parameter 1: *
R17 = Resistor_1206: Manufacturer: Yageo; PartNumber: RC1206JR-07100RL; ValueManufacturerPartNumber: Resistor film, 6.8k, ±5%, 1206, 0.25W, -55...+125°C; TypeResistor: Resistor film; Power: 0.25W; Tolerance: ±5%; Package: 1206; HelpURL: https://www.digikey.com/product-detail/en/yageo/RC1206JR-07100RL/311-100ERCT-ND/732153; Temperature: -55...+125°C; Parameter 1: *
R19 = Resistor_1206: Manufacturer: Yageo; PartNumber: RC1206JR-07100RL; ValueManufacturerPartNumber: Resistor film, 22k, ±5%, 1206, 0.25W, -55...+125°C; TypeResistor: Resistor film; Power: 0.25W; Tolerance: ±5%; Package: 1206; HelpURL: https://www.digikey.com/product-detail/en/yageo/RC1206JR-07100RL/311-100ERCT-ND/732153; Temperature: -55...+125°C; Parameter 1: *
R20 = Resistor_1206: Manufacturer: Yageo; PartNumber: RC1206JR-07100RL; ValueManufacturerPartNumber: Resistor film, 30k, ±5%, 1206, 0.25W, -55...+125°C; TypeResistor: Resistor film; Power: 0.25W; Tolerance: ±5%; Package: 1206; HelpURL: https://www.digikey.com/product-detail/en/yageo/RC1206JR-07100RL/311-100ERCT-ND/732153; Temperature: -55...+125°C; Parameter 1: *
R21 = Resistor_1206: Manufacturer: Yageo; PartNumber: RC1206JR-07100RL; ValueManufacturerPartNumber: Resistor film, 100, ±5%, 1206, 0.25W, -55...+125°C; TypeResistor: Resistor film; Power: 0.25W; Tolerance: ±5%; Package: 1206; HelpURL: https://www.digikey.com/product-detail/en/yageo/RC1206JR-07100RL/311-100ERCT-ND/732153; Temperature: -55...+125°C; Parameter 1: *
R23 = Resistor_1206: as R2 on sheet Hard_rele_310v_24v_test; Package: 1206; HelpURL: https://www.digikey.com/product-detail/en/yageo/RC1206JR-07100RL/311-100ERCT-ND/732153; Temperature: -55...+125°C; Parameter 1: *
R25 = THT_R_6mm_1

## Sheet Transform_310_310.SchDoc
size C; SheetNumber: 5; SheetTotal: 9
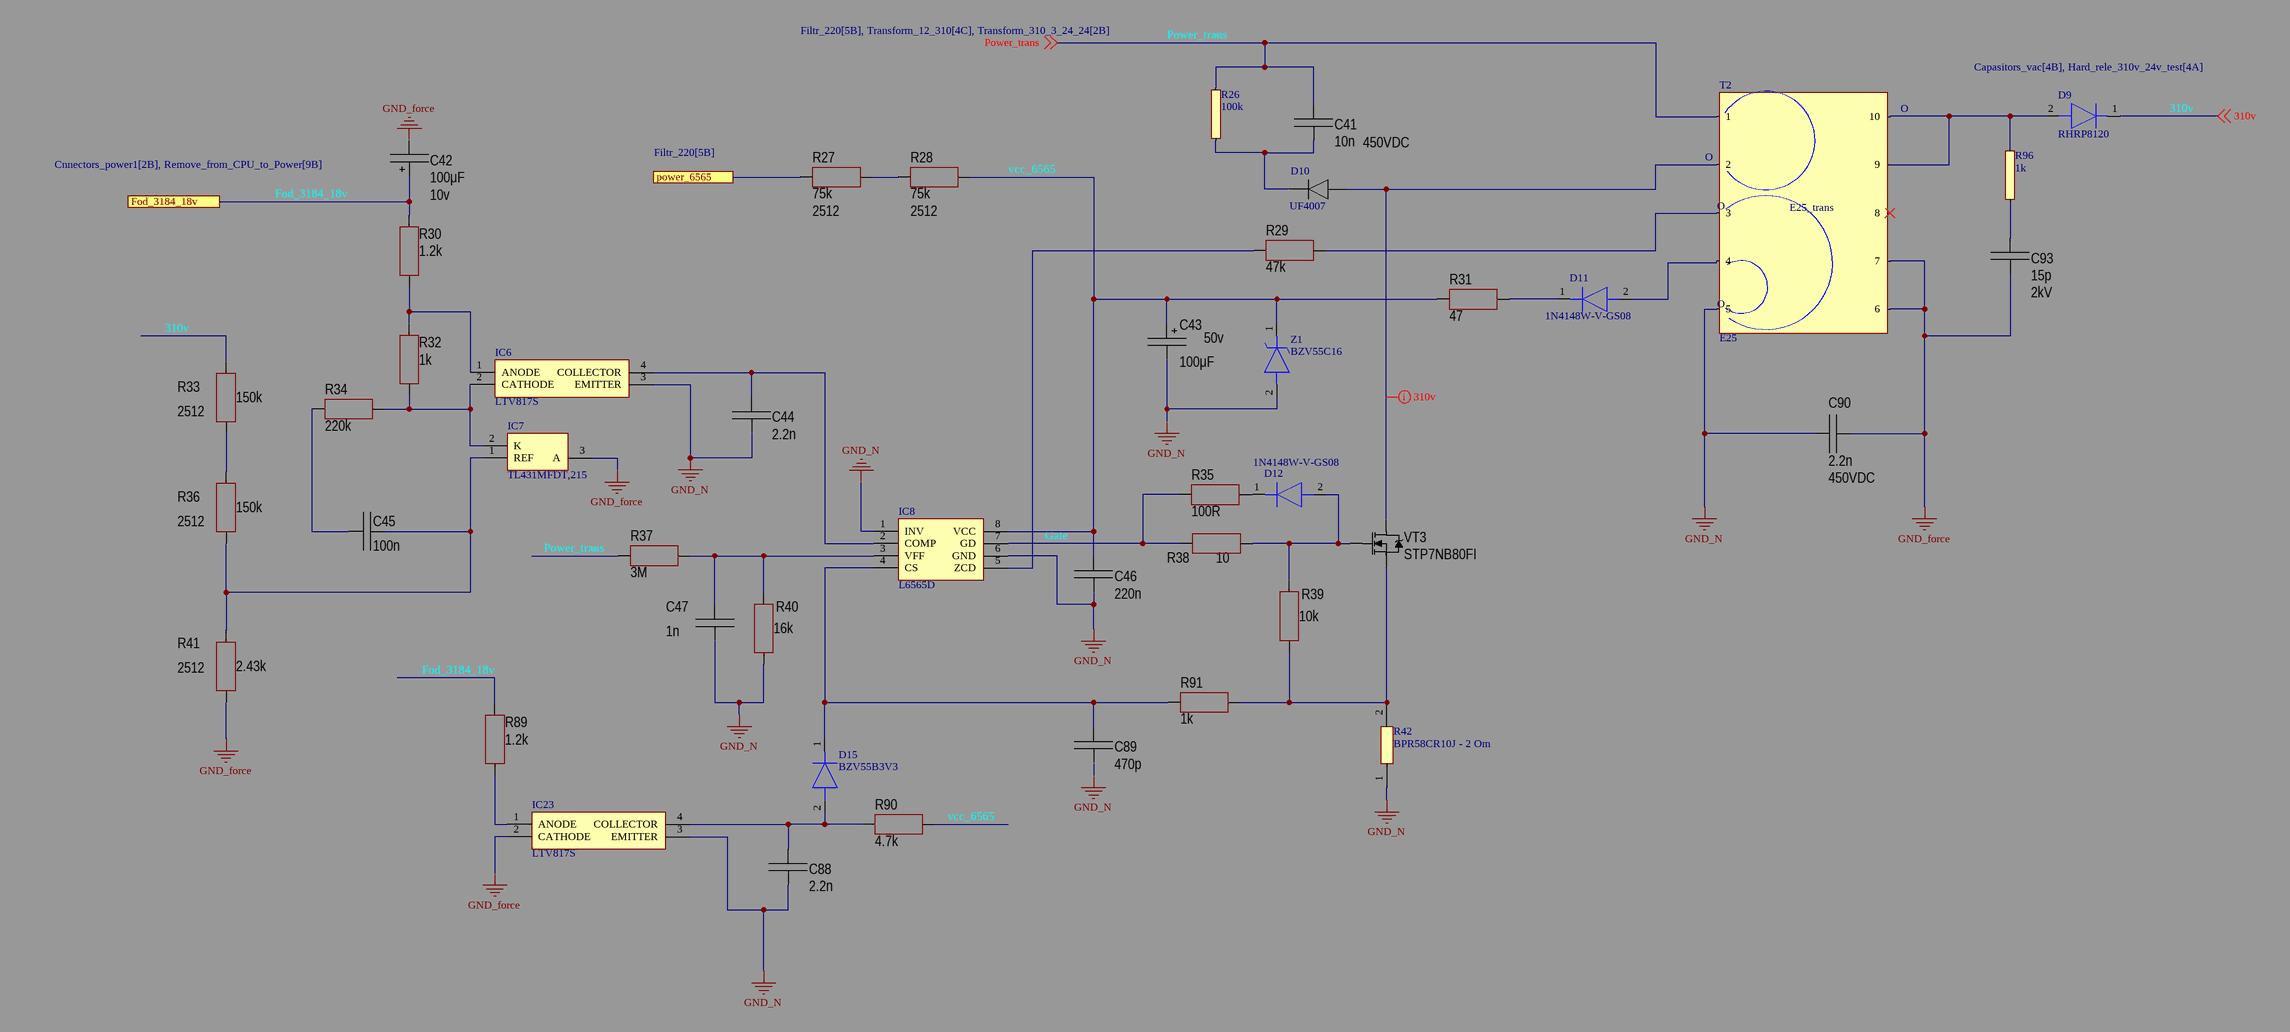
[diagram p4: Transform_310_310.SchDoc]

### Parts
C41  value 10n  Voltage: 450VDC  [CAP: AY2102M29Y5US63L7]
C42  value 100μF  Voltage: 10v  [CAP: D8C3.5H12]
C43  value 100μF  Voltage: 50v  [CAP: D8C3.5H12]
C44  value 2.2n  [CAP: 1206]
C45  value 100n  [CAP: 1206]
C46  value 220n  [CAP: 1206]
C47  value 1n  [CAP: 1206]
C88  value 2.2n  [CAP: 1206]
C89  value 470p  [CAP: 1206]
C90  value 2.2n  Voltage: 450VDC  [CAP: AY2102M29Y5US63L7]
C93  value 15p  Voltage: 2kV  [CAP: AY2102M29Y5US63L7]
D9  RHRP8120  [TO508P467X1023X1923-2P]
D10  UF4007  [THT_D_6mm_1]
D11  1N4148W-V-GS08  [1N4148WVGS08]
D12  1N4148W-V-GS08  [1N4148WVGS08]
D15  BZV55B3V3  [BZV55B3V3]
IC6  LTV817S  [SOP254P1016X460-4N]
IC7  TL431MFDT,215  [SOT95P230X110-3N]
IC8  L6565D  [SOIC127P600X175-8N]
IC23  LTV817S  [SOP254P1016X460-4N]
R26  100k  [THT_R_6mm_1]
R27  value 75k  Tolerance: 2512  [RES: 2512]
R28  value 75k  Tolerance: 2512  [RES: 2512]
R29  value 47k  [RES: 1206]
R30  value 1.2k  [RES: 1206]
R31  value 47  [RES: 1206]
R32  value 1k  [RES: 1206]
R33  value 150k  Tolerance: 2512  [RES: 2512]
R34  value 220k  [RES: 1206]
R35  value 100R  [RES: 1206]
R36  value 150k  Tolerance: 2512  [RES: 2512]
R37  value 3M  [RES: 1206]
R38  value 10  [RES: 1206]
R39  value 10k  [RES: 1206]
R40  value 16k  [RES: 1206]
R41  value 2.43k  Tolerance: 2512  [RES: 2512]
R42  BPR58CR10J - 2 Om  [BPR58CR10J]
R89  value 1.2k  [RES: 1206]
R90  value 4.7k  [RES: 1206]
R91  value 1k  [RES: 1206]
R96  1k  [THT_R_6mm_1]
T2  E25  [E25]
VT3  PartNumber: STP7NB80FI  [TO220]
Z1  BZV55C16  [BZV55C18]

### Ports
Fod_3184_18v (see Cnnectors_power1[2B], Remove_from_CPU_to_Power[9B]), power_6565 (see Filtr_220[5B])

### Nets
GND_force: C42.2 C90.2 C93.1 IC7.3(A) IC23.2(CATHODE) R41.1 T2.6 T2.7
GND_N: C43.2 C44.2 C46.1 C47.2 C88.2 C89.2 C90.1 IC6.3(EMITTER) IC8.1(INV) IC8.6(GND) IC23.3(EMITTER) R40.1 R42.1 T2.5 Z1.2(A)
310v: D9.1(K) R33.2 ; off-sheet 310v
Fod_3184_18v: C42.1 R30.1 R89.1 ; port Fod_3184_18v
Gate: IC8.7(GD) R35.1 R38.1
power_6565: R27.1 ; port power_6565
Power_trans: C41.1 R26.2 R37.1 T2.1 ; off-sheet Power_trans
vcc_6565: C43.1 C46.2 IC8.8(VCC) R28.2 R31.1 R90.2 Z1.1(K)
NetC41_2: C41.2 D10.2 R26.1
NetC44_1: C44.1 IC6.4(COLLECTOR) IC8.2(COMP)
NetC45_1: C45.1 IC7.1(REF) R36.1 R41.2
NetC45_2: C45.2 R34.1
NetC47_1: C47.1 IC8.3(VFF) R37.2 R40.2
NetC88_1: C88.1 D15.2(A) IC23.4(COLLECTOR) R90.1
NetC89_1: C89.1 D15.1(K) IC8.4(CS) R91.1
NetC93_2: C93.2 R96.1
NetD9_2: D9.2(A) R96.2 T2.9 T2.10
NetD10_1: D10.1 T2.2 VT3.2(D)
NetD11_1: D11.1(K) R31.2
NetD11_2: D11.2(A) T2.4
NetD12_1: D12.1(K) R35.2
NetD12_2: D12.2(A) R38.2 R39.2 VT3.1(G)
NetIC6_1: IC6.1(ANODE) R30.2 R32.2
NetIC6_2: IC6.2(CATHODE) IC7.2(K) R32.1 R34.2
NetIC8_5: IC8.5(ZCD) R29.1
NetIC23_1: IC23.1(ANODE) R89.2
NetR27_2: R27.2 R28.1
NetR29_2: R29.2 T2.3
NetR33_1: R33.1 R36.2
NetR39_1: R39.1 R42.2 R91.2 VT3.3(S)

Not connected (* = marked no-connect by the designer): T2 8*

### Layout directives
net class 310v: NetD10_1

### Notes on the sheet
- (near T2) O
- (in symbol E25) E25_trans

### Library data of the parts
C41 = Film: Manufacturer: Epcos; PartNumber: B32774D4106K000; ValueManufacturerPartNumber: Film capacitor, 10n, 450VDC, ±10%, 10.9mOhm, 31.5x15 mm, -40...+105°C; TypeCapacitor: Film capacitor; Tolerance: ±10%; Impedance: 10.9mOhm; Package: 31.5x15 mm; HelpURL: https://www.digikey.com/products/en/capacitors/film-capacitors/62?k=&pkeyword=&sv=0&pv2097=1958&sf=0&FV=fffc01ef%2C1f140000%2Cffe0003e%2Cffec6366&quantity=1&ColumnSort=1000011&page=1&stock=1&pageSize=25; Temperature: -40...+105°C
C42 = Aluminium: Manufacturer: Wurth; PartNumber: 860080475013; ValueManufacturerPartNumber: Aluminium capacitor, 100μF, 10v, ±20%, 54mOhm, 14x10x5 mm, -55...+105°C; TypeCapacitor: Aluminium capacitor; Tolerance: ±20%; Impedance: 54mOhm; Package: 14x10x5 mm; HelpURL: https://www.digikey.com/product-detail/en/wurth-electronics-inc/860080475013/732-9029-1-ND/5728972; Temperature: -55...+105°C
C43 = Aluminium: Manufacturer: Wurth; PartNumber: 860080475013; ValueManufacturerPartNumber: Aluminium capacitor, 100μF, 50v, ±20%, 54mOhm, 14x10x5 mm, -55...+105°C; TypeCapacitor: Aluminium capacitor; Tolerance: ±20%; Impedance: 54mOhm; Package: 14x10x5 mm; HelpURL: https://www.digikey.com/product-detail/en/wurth-electronics-inc/860080475013/732-9029-1-ND/5728972; Temperature: -55...+105°C
C44 C88 = Ceramic_1206: as C23 on sheet Transform_12_310; Package: 1206; HelpURL: https://www.digikey.com/product-detail/en/yageo/CC1206KRX7R9BB104/311-1179-1-ND/303089; Temperature: -55...+125°C
C45 = Ceramic_1206: Manufacturer: Yageo; PartNumber: CC1206KRX7R9BB104; ValueManufacturerPartNumber: Ceramic capacitor, 100n, X7R, ±10%, 50V, 1206, -55...+125°C; TypeCapacitor: Ceramic capacitor; Tolerance: ±10%; TypeDielectric: X7R; Voltage: 50V; Package: 1206; HelpURL: https://www.digikey.com/product-detail/en/yageo/CC1206KRX7R9BB104/311-1179-1-ND/303089; Temperature: -55...+125°C
C46 = Ceramic_1206: Manufacturer: Yageo; PartNumber: CC1206KRX7R9BB104; ValueManufacturerPartNumber: Ceramic capacitor, 220n, X7R, ±10%, 50V, 1206, -55...+125°C; TypeCapacitor: Ceramic capacitor; Tolerance: ±10%; TypeDielectric: X7R; Voltage: 50V; Package: 1206; HelpURL: https://www.digikey.com/product-detail/en/yageo/CC1206KRX7R9BB104/311-1179-1-ND/303089; Temperature: -55...+125°C
C47 = Ceramic_1206: as C28 on sheet Transform_12_310; Package: 1206; HelpURL: https://www.digikey.com/product-detail/en/yageo/CC1206KRX7R9BB104/311-1179-1-ND/303089; Temperature: -55...+125°C
C89 = Ceramic_1206: Manufacturer: Yageo; PartNumber: CC1206KRX7R9BB104; ValueManufacturerPartNumber: Ceramic capacitor, 470p, X7R, ±10%, 50V, 1206, -55...+125°C; TypeCapacitor: Ceramic capacitor; Tolerance: ±10%; TypeDielectric: X7R; Voltage: 50V; Package: 1206; HelpURL: https://www.digikey.com/product-detail/en/yageo/CC1206KRX7R9BB104/311-1179-1-ND/303089; Temperature: -55...+125°C
C90 = Film: as C92 on sheet Transform_12_310; Package: 31.5x15 mm; HelpURL: https://www.digikey.com/products/en/capacitors/film-capacitors/62?k=&pkeyword=&sv=0&pv2097=1958&sf=0&FV=fffc01ef%2C1f140000%2Cffe0003e%2Cffec6366&quantity=1&ColumnSort=1000011&page=1&stock=1&pageSize=25; Temperature: -40...+105°C
C93 = Film: Manufacturer: Epcos; PartNumber: B32774D4106K000; ValueManufacturerPartNumber: Film capacitor, 15p, 2kV, ±10%, 10.9mOhm, 31.5x15 mm, -40...+105°C; TypeCapacitor: Film capacitor; Tolerance: ±10%; Impedance: 10.9mOhm; Package: 31.5x15 mm; HelpURL: https://www.digikey.com/products/en/capacitors/film-capacitors/62?k=&pkeyword=&sv=0&pv2097=1958&sf=0&FV=fffc01ef%2C1f140000%2Cffe0003e%2Cffec6366&quantity=1&ColumnSort=1000011&page=1&stock=1&pageSize=25; Temperature: -40...+105°C
D9 = RHRP8120: Diode; Manufacturer_Name: onsemi; Datasheet Link: https://www.onsemi.com/pub/Collateral/RHRP8120-D.PDF; Height: 4.672mm; Manufacturer_Part_Number: RHRP8120; Mouser Part Number: 512-RHRP8120; Mouser Price/Stock: https://www.mouser.co.uk/ProductDetail/onsemi-Fairchild/RHRP8120?qs=UeXq8qLVREGknIOnwE%2FlEA%3D%3D; Arrow Part Number: RHRP8120; Arrow Price/Stock: https://www.arrow.com/en/products/rhrp8120/on-semiconductor
D10 = THT_D_6mm_1
D11 D12 = 1N4148W-V-GS08: Diode; Manufacturer_Name: Vishay; Datasheet Link: https://us.rs-online.com/m/d/a2789c8794cb0c42ced29f2dd8571f3c.pdf; Height: 1.35mm; Manufacturer_Part_Number: 1N4148W-V-GS08; Mouser Part Number: 625-1N4148W-V; Mouser Price/Stock: https://www.mouser.co.uk/ProductDetail/Vishay-Semiconductors/1N4148W-V-GS08?qs=TNTIDjy6APrS%2Fdgq1RSs3A%3D%3D; Arrow Part Number: 1N4148W-V-GS08; Arrow Price/Stock: https://www.arrow.com/en/products/1n4148w-v-gs08/vishay
D15 = BZV55B3V3: Diode; Manufacturer_Name: Nexperia; Datasheet Link: https://assets.nexperia.com/documents/data-sheet/BZV55_SER.pdf; Height: 1.6mm; Manufacturer_Part_Number: BZV55B3V3
IC6 IC23 = LTV817S: Integrated Circuit; Manufacturer_Name: Lite-On; Datasheet Link: https://www.arrow.com/en/products/ltv-817s/lite-on-technology; Height: 4.6mm; Manufacturer_Part_Number: LTV817S; Arrow Part Number: LTV817S; Arrow Price/Stock: https://www.arrow.com/en/products/ltv-817s/lite-on-technology
IC7 = TL431MFDT,215: Integrated Circuit; Manufacturer_Name: Nexperia; Datasheet Link: https://assets.nexperia.com/documents/data-sheet/TL431_FAM.pdf; Height: 1.1mm; Manufacturer_Part_Number: TL431MFDT,215; Mouser Part Number: 771-TL431MFDT215; Mouser Price/Stock: https://www.mouser.co.uk/ProductDetail/Nexperia/TL431MFDT215?qs=A1cBxND5mHKvFzVl3lBdcQ%3D%3D; Arrow Part Number: TL431MFDT,215; Arrow Price/Stock: https://www.arrow.com/en/products/tl431mfdt215/nexperia?utm_currency=USD&region=nac
IC8 = L6565D: Integrated Circuit; Manufacturer_Name: STMicroelectronics; Datasheet Link: https://www.st.com/resource/en/datasheet/l6565.pdf; Height: 1.75mm; Manufacturer_Part_Number: L6565D; Mouser Part Number: 511-L6565D; Mouser Price/Stock: https://www.mouser.co.uk/ProductDetail/STMicroelectronics/L6565D/?qs=sps7W%2FwBcGGH47tz0cin9g%3D%3D; Arrow Part Number: L6565D; Arrow Price/Stock: https://www.arrow.com/en/products/l6565d/stmicroelectronics
R26 R96 = THT_R_6mm_1
R27 R28 = Resistor_2512: Manufacturer: Yageo; PartNumber: RC2512JK-07100RL; ValueManufacturerPartNumber: Resistor film, 75k, 2512, 2512, 1W, -55...+125°C; TypeResistor: Resistor film; Power: 1W; Package: 2512; HelpURL: https://www.digikey.com/product-detail/en/yageo/RC2512JK-07100RL/YAG3393CT-ND/5962215; Temperature: -55...+125°C
R29 = Resistor_1206: Manufacturer: Yageo; PartNumber: RC1206JR-07100RL; ValueManufacturerPartNumber: Resistor film, 47k, ±5%, 1206, 0.25W, -55...+125°C; TypeResistor: Resistor film; Power: 0.25W; Tolerance: ±5%; Package: 1206; HelpURL: https://www.digikey.com/product-detail/en/yageo/RC1206JR-07100RL/311-100ERCT-ND/732153; Temperature: -55...+125°C
R30 R89 = Resistor_1206: Manufacturer: Yageo; PartNumber: RC1206JR-07100RL; ValueManufacturerPartNumber: Resistor film, 1.2k, ±5%, 1206, 0.25W, -55...+125°C; TypeResistor: Resistor film; Power: 0.25W; Tolerance: ±5%; Package: 1206; HelpURL: https://www.digikey.com/product-detail/en/yageo/RC1206JR-07100RL/311-100ERCT-ND/732153; Temperature: -55...+125°C
R31 = Resistor_1206: as R15 on sheet Transform_12_310; Package: 1206; HelpURL: https://www.digikey.com/product-detail/en/yageo/RC1206JR-07100RL/311-100ERCT-ND/732153; Temperature: -55...+125°C
R32 R91 = Resistor_1206: as R2 on sheet Hard_rele_310v_24v_test; Package: 1206; HelpURL: https://www.digikey.com/product-detail/en/yageo/RC1206JR-07100RL/311-100ERCT-ND/732153; Temperature: -55...+125°C
R33 R36 = Resistor_2512: Manufacturer: Yageo; PartNumber: RC2512JK-07100RL; ValueManufacturerPartNumber: Resistor film, 150k, 2512, 2512, 1W, -55...+125°C; TypeResistor: Resistor film; Power: 1W; Package: 2512; HelpURL: https://www.digikey.com/product-detail/en/yageo/RC2512JK-07100RL/YAG3393CT-ND/5962215; Temperature: -55...+125°C
R34 = Resistor_1206: Manufacturer: Yageo; PartNumber: RC1206JR-07100RL; ValueManufacturerPartNumber: Resistor film, 220k, ±5%, 1206, 0.25W, -55...+125°C; TypeResistor: Resistor film; Power: 0.25W; Tolerance: ±5%; Package: 1206; HelpURL: https://www.digikey.com/product-detail/en/yageo/RC1206JR-07100RL/311-100ERCT-ND/732153; Temperature: -55...+125°C
R35 = Resistor_1206: Manufacturer: Yageo; PartNumber: RC1206JR-07100RL; ValueManufacturerPartNumber: Resistor film, 100R, ±5%, 1206, 0.25W, -55...+125°C; TypeResistor: Resistor film; Power: 0.25W; Tolerance: ±5%; Package: 1206; HelpURL: https://www.digikey.com/product-detail/en/yageo/RC1206JR-07100RL/311-100ERCT-ND/732153; Temperature: -55...+125°C
R37 = Resistor_1206: Manufacturer: Yageo; PartNumber: RC1206JR-07100RL; ValueManufacturerPartNumber: Resistor film, 3M, ±5%, 1206, 0.25W, -55...+125°C; TypeResistor: Resistor film; Power: 0.25W; Tolerance: ±5%; Package: 1206; HelpURL: https://www.digikey.com/product-detail/en/yageo/RC1206JR-07100RL/311-100ERCT-ND/732153; Temperature: -55...+125°C
R38 = Resistor_1206: as R9 on sheet Transform_12_310; Package: 1206; HelpURL: https://www.digikey.com/product-detail/en/yageo/RC1206JR-07100RL/311-100ERCT-ND/732153; Temperature: -55...+125°C
R39 = Resistor_1206: as R8 on sheet Transform_12_310; Package: 1206; HelpURL: https://www.digikey.com/product-detail/en/yageo/RC1206JR-07100RL/311-100ERCT-ND/732153; Temperature: -55...+125°C
R40 = Resistor_1206: Manufacturer: Yageo; PartNumber: RC1206JR-07100RL; ValueManufacturerPartNumber: Resistor film, 16k, ±5%, 1206, 0.25W, -55...+125°C; TypeResistor: Resistor film; Power: 0.25W; Tolerance: ±5%; Package: 1206; HelpURL: https://www.digikey.com/product-detail/en/yageo/RC1206JR-07100RL/311-100ERCT-ND/732153; Temperature: -55...+125°C
R41 = Resistor_2512: Manufacturer: Yageo; PartNumber: RC2512JK-07100RL; ValueManufacturerPartNumber: Resistor film, 2.43k, 2512, 2512, 1W, -55...+125°C; TypeResistor: Resistor film; Power: 1W; Package: 2512; HelpURL: https://www.digikey.com/product-detail/en/yageo/RC2512JK-07100RL/YAG3393CT-ND/5962215; Temperature: -55...+125°C
R42 = BPR58CR10J: Resistor; Manufacturer_Name: KOA Speer; Datasheet Link: https://www.koaspeer.com/catimages/Products/BPR/BPR.pdf; Height: 19mm; Manufacturer_Part_Number: BPR58CR10J; Mouser Part Number: 660-BPR58CR10J; Mouser Price/Stock: https://www.mouser.co.uk/ProductDetail/KOA-Speer/BPR58CR10J?qs=c3C3yipULq1EyCkbnj3nTQ%3D%3D; Arrow Part Number: BPR58CR10J; Arrow Price/Stock: https://www.arrow.com/en/products/bpr58cr10j/koa-speer-electronics.html?utm_currency=USD&region=nac
R90 = Resistor_1206: Manufacturer: Yageo; PartNumber: RC1206JR-07100RL; ValueManufacturerPartNumber: Resistor film, 4.7k, ±5%, 1206, 0.25W, -55...+125°C; TypeResistor: Resistor film; Power: 0.25W; Tolerance: ±5%; Package: 1206; HelpURL: https://www.digikey.com/product-detail/en/yageo/RC1206JR-07100RL/311-100ERCT-ND/732153; Temperature: -55...+125°C
VT3 = MOSFET_N_123: Manufacturer: Infineon Technologies; ValueManufacturerPartNumber: MOSFET N-channel transistor, 80V, 7A, 9.1nC, 2.5W, 34mOhm, 756pF, 8-TDSON, -55...+150°C; TypeTransistor: MOSFET N-channel transistor; VoltageDS: 80V; CurrentDS: 7A; RDS: 34mOhm; GateCharge: 9.1nC; InputCapacitor: 756pF; MaxPower: 2.5W; Package: 8-TDSON; HelpURL: https://www.digikey.com/product-detail/en/infineon-technologies/BSC340N08NS3GATMA1/BSC340N08NS3GATMA1TR-ND/2080655; Temperature: -55...+150°C
Z1 = BZV55C18: Zener Diode; Manufacturer_Name: Microchip; Datasheet Link: https://www.microsemi.com/document-portal/doc_download/8298-bzv55-c2v4-c75-datasheet; Height: 1.7mm; Manufacturer_Part_Number: BZV55C18; Mouser Part Number: 494-BZV55C18; Mouser Price/Stock: https://www.mouser.co.uk/ProductDetail/Microchip-Technology/BZV55C18?qs=w%2Fv1CP2dgqosS2q5rh%252BhPQ%3D%3D; Arrow Part Number: BZV55C18; Arrow Price/Stock: https://www.arrow.com/en/products/bzv55c18/microchip-technology.html?utm_currency=USD&region=nac

## Sheet Transform_310_3_24_24.SchDoc
size A; SheetNumber: 6; SheetTotal: 9
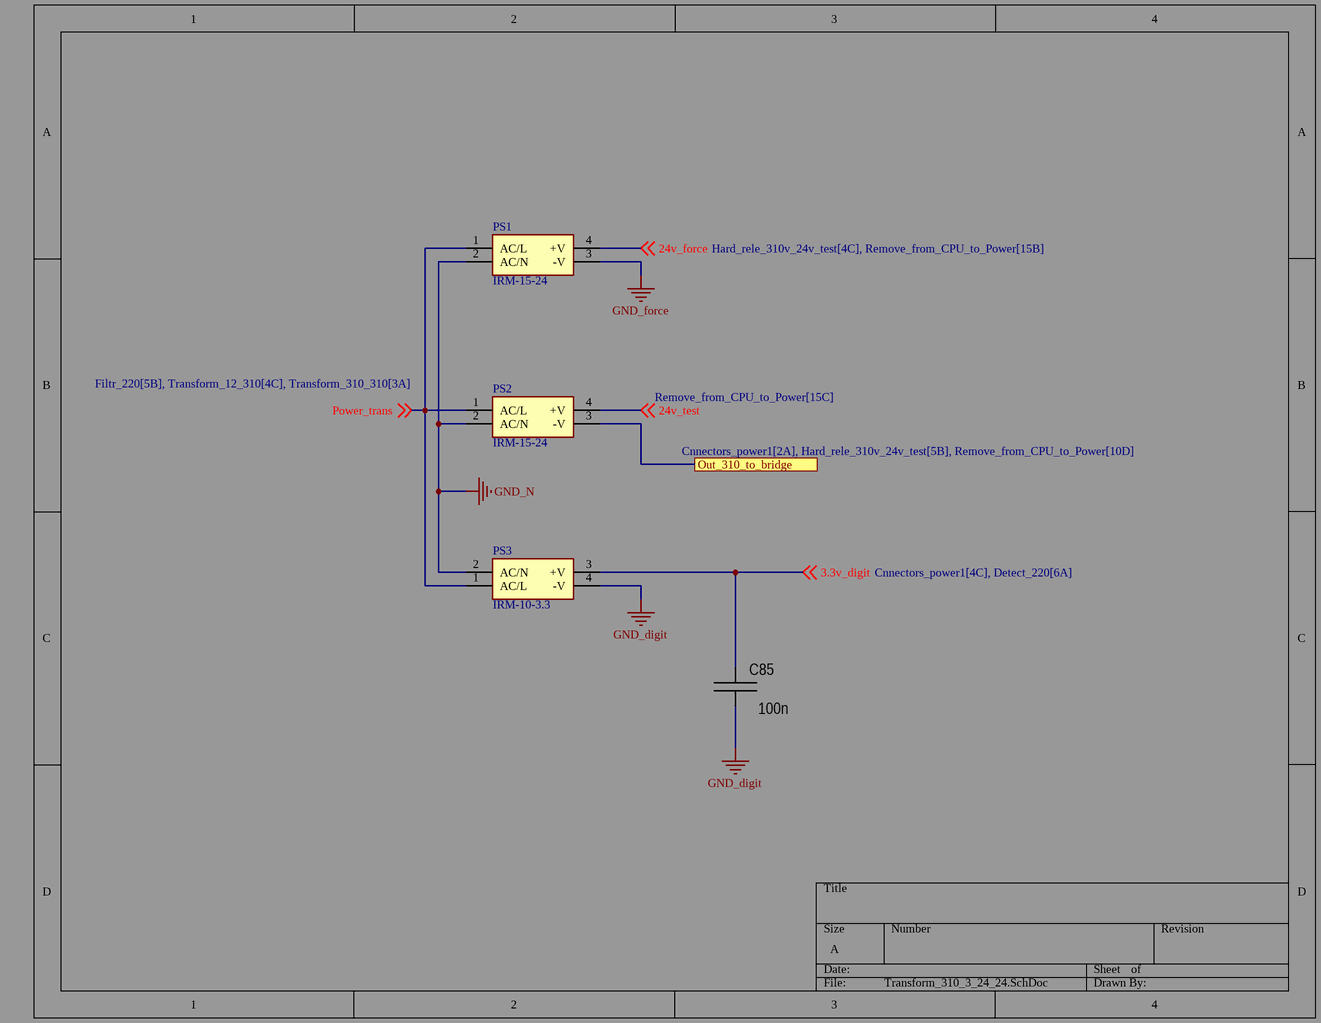
[diagram p5: Transform_310_3_24_24.SchDoc]

### Parts
C85  value 100n  [CAP: 1206]
PS1  IRM-15-24  [IRM-15-5]
PS2  IRM-15-24  [IRM-15-5]
PS3  IRM-10-3.3  [IRM1033]

### Ports
Out_310_to_bridge (see Cnnectors_power1[2A], Hard_rele_310v_24v_test[5B], Remove_from_CPU_to_Power[10D])

### Nets
GND_digit: C85.1 PS3.4(-V)
GND_force: PS1.3(-V)
GND_N: PS1.2(AC/N) PS2.2(AC/N) PS3.2(AC/N)
3.3v_digit: C85.2 PS3.3(+V) ; off-sheet 3.3v_digit
24v_force: PS1.4(+V) ; off-sheet 24v_force
24v_test: PS2.4(+V) ; off-sheet 24v_test
Out_310_to_bridge: PS2.3(-V) ; port Out_310_to_bridge
Power_trans: PS1.1(AC/L) PS2.1(AC/L) PS3.1(AC/L) ; off-sheet Power_trans

### Library data of the parts
C85 = Ceramic_1206: as C45 on sheet Transform_310_310; Package: 1206; HelpURL: https://www.digikey.com/product-detail/en/yageo/CC1206KRX7R9BB104/311-1179-1-ND/303089; Temperature: -55...+125°C
PS1 PS2 = IRM-15-24: Power Supply; Manufacturer_Name: Mean Well; Datasheet Link: https://componentsearchengine.com/Datasheets/2/IRM-15-24.pdf; Manufacturer_Part_Number: IRM-15-24; Mouser Part Number: 709-IRM15-24; Mouser Price/Stock: https://www.mouser.co.uk/ProductDetail/MEAN-WELL/IRM-15-24?qs=WkdRfq4wf1PZSEWhZtKDbQ%3D%3D; Arrow Part Number: IRM-15-24; Arrow Price/Stock: https://www.arrow.com/en/products/irm-15-24/mean-well-enterprises?utm_currency=USD&region=europe
PS3 = IRM-10-3.3: Power Supply; Manufacturer_Name: Mean Well; Datasheet Link: https://datasheet.datasheetarchive.com/originals/distributors/DKDS-14/277831.pdf; Height: 21.5mm; Manufacturer_Part_Number: IRM-10-3.3; Mouser Part Number: 709-IRM10-3.3; Mouser Price/Stock: https://www.mouser.co.uk/ProductDetail/MEAN-WELL/IRM-10-3.3?qs=WkdRfq4wf1M%252Ba4IjD903Hw%3D%3D; Arrow Part Number: IRM-10-3.3; Arrow Price/Stock: https://www.arrow.com/en/products/irm-10-3.3/mean-well-enterprises?region=nac

## Sheet Detect_220.SchDoc
size C; SheetNumber: 7; SheetTotal: 9
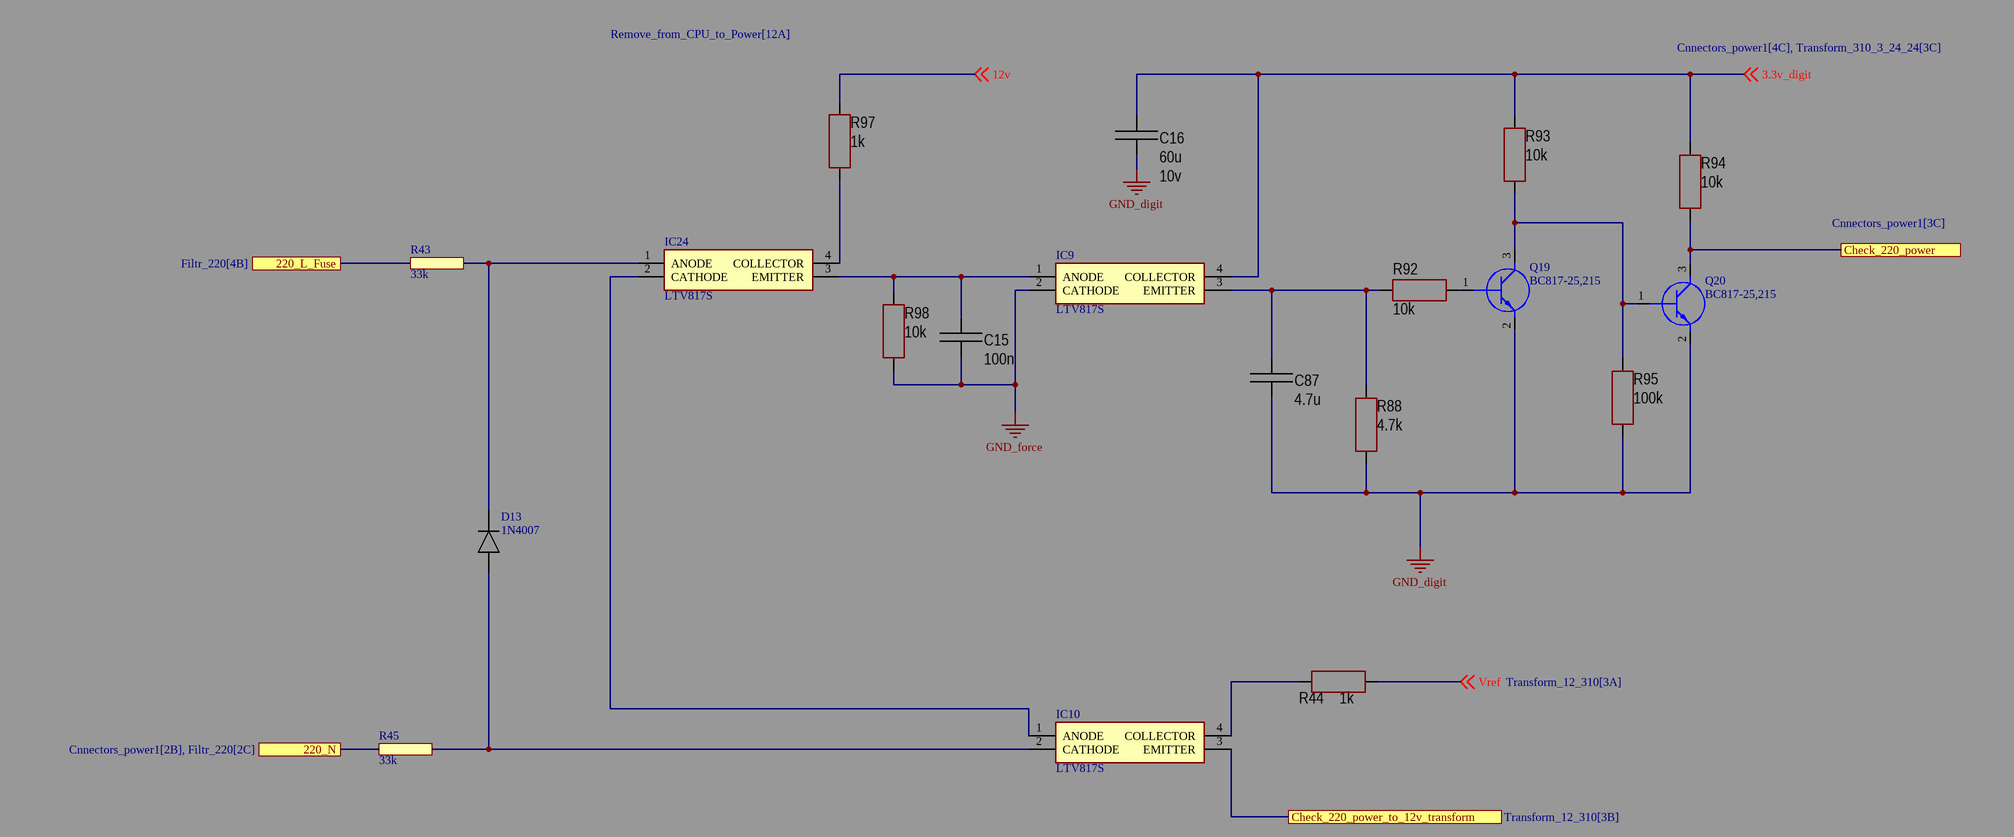
[diagram p6: Detect_220.SchDoc]

### Parts
C15  value 100n  [CAP: 1206]
C16  value 60u  Voltage: 10v  [CAP: 1206]
C87  value 4.7u  [CAP: 1206]
D13  1N4007  [THT_D_6mm_1]
IC9  LTV817S  [SOP254P1016X460-4N]
IC10  LTV817S  [SOP254P1016X460-4N]
IC24  LTV817S  [SOP254P1016X460-4N]
Q19  BC817-25,215  [BC81725215]
Q20  BC817-25,215  [BC81725215]
R43  33k  [THT_R_6mm_1]
R44  value 1k  [RES: 1206]
R45  33k  [THT_R_6mm_1]
R88  value 4.7k  [RES: 1206]
R92  value 10k  [RES: 1206]
R93  value 10k  [RES: 1206]
R94  value 10k  [RES: 1206]
R95  value 100k  [RES: 1206]
R97  value 1k  [RES: 1206]
R98  value 10k  [RES: 1206]

### Ports
220_L_Fuse (see Filtr_220[4B]), 220_N (see Cnnectors_power1[2B], Filtr_220[2C]), Check_220_power (see Cnnectors_power1[3C]), Check_220_power_to_12v_transform (see Transform_12_310[3B])

### Nets
GND_digit: C16.1 C87.1 Q19.2(E) Q20.2(E) R88.1 R95.1
GND_force: C15.1 IC9.2(CATHODE) R98.2
3.3v_digit: C16.2 IC9.4(COLLECTOR) R93.2 R94.2 ; off-sheet 3.3v_digit
12v: R97.2 ; off-sheet 12v
220_L_Fuse: R43.1 ; port 220_L_Fuse
220_N: R45.1 ; port 220_N
Check_220_power: Q20.3(C) R94.1 ; port Check_220_power
Check_220_power_to_12v_transform: IC10.3(EMITTER) ; port Check_220_power_to_12v_transform
Vref: R44.2 ; off-sheet Vref
NetC15_2: C15.2 IC9.1(ANODE) IC24.3(EMITTER) R98.1
NetC87_2: C87.2 IC9.3(EMITTER) R88.2 R92.2
NetD13_1: D13.1 IC10.2(CATHODE) R45.2
NetD13_2: D13.2 IC24.1(ANODE) R43.2
NetIC10_1: IC10.1(ANODE) IC24.2(CATHODE)
NetIC10_4: IC10.4(COLLECTOR) R44.1
NetIC24_4: IC24.4(COLLECTOR) R97.1
NetQ19_1: Q19.1(B) R92.1
NetQ19_3: Q19.3(C) Q20.1(B) R93.1 R95.2

### Library data of the parts
C15 = Ceramic_1206: as C45 on sheet Transform_310_310; Package: 1206; HelpURL: https://www.digikey.com/product-detail/en/yageo/CC1206KRX7R9BB104/311-1179-1-ND/303089; Temperature: -55...+125°C
C16 = Ceramic_1206: Manufacturer: Yageo; PartNumber: CC1206KRX7R9BB104; ValueManufacturerPartNumber: Ceramic capacitor, 60u, X7R, ±10%, 10v, 1206, -55...+125°C; TypeCapacitor: Ceramic capacitor; Tolerance: ±10%; TypeDielectric: X7R; Package: 1206; HelpURL: https://www.digikey.com/product-detail/en/yageo/CC1206KRX7R9BB104/311-1179-1-ND/303089; Temperature: -55...+125°C
C87 = Ceramic_1206: Manufacturer: Yageo; PartNumber: CC1206KRX7R9BB104; ValueManufacturerPartNumber: Ceramic capacitor, 4.7u, X7R, ±10%, 50V, 1206, -55...+125°C; TypeCapacitor: Ceramic capacitor; Tolerance: ±10%; TypeDielectric: X7R; Voltage: 50V; Package: 1206; HelpURL: https://www.digikey.com/product-detail/en/yageo/CC1206KRX7R9BB104/311-1179-1-ND/303089; Temperature: -55...+125°C
D13 = THT_D_6mm_1
IC9 IC10 IC24 = LTV817S: as IC6 on sheet Transform_310_310; Datasheet Link: https://www.arrow.com/en/products/ltv-817s/lite-on-technology; Height: 4.6mm; Manufacturer_Part_Number: LTV817S; Arrow Part Number: LTV817S; Arrow Price/Stock: https://www.arrow.com/en/products/ltv-817s/lite-on-technology
Q19 Q20 = BC817-25,215_1: Transistor BJT NPN; Manufacturer_Name: Nexperia; Datasheet Link: https://assets.nexperia.com/documents/data-sheet/BC817_SER.pdf; Height: 1.1mm; Manufacturer_Part_Number: BC817-25,215; Mouser Part Number: 771-BC817-25-T/R; Mouser Price/Stock: https://www.mouser.co.uk/ProductDetail/Nexperia/BC817-25215?qs=me8TqzrmIYUj67JkTBzlfg%3D%3D; Arrow Part Number: BC817-25,215; Arrow Price/Stock: https://www.arrow.com/en/products/bc817-25215/nexperia?region=nac
R43 R45 = THT_R_6mm_1
R44 R97 = Resistor_1206: as R2 on sheet Hard_rele_310v_24v_test; Package: 1206; HelpURL: https://www.digikey.com/product-detail/en/yageo/RC1206JR-07100RL/311-100ERCT-ND/732153; Temperature: -55...+125°C
  R44: Parameter 1: *
R88 = Resistor_1206: as R90 on sheet Transform_310_310; Package: 1206; HelpURL: https://www.digikey.com/product-detail/en/yageo/RC1206JR-07100RL/311-100ERCT-ND/732153; Temperature: -55...+125°C
R92-R94 R98 = Resistor_1206: as R8 on sheet Transform_12_310; Package: 1206; HelpURL: https://www.digikey.com/product-detail/en/yageo/RC1206JR-07100RL/311-100ERCT-ND/732153; Temperature: -55...+125°C
R95 = Resistor_1206: Manufacturer: Yageo; PartNumber: RC1206JR-07100RL; ValueManufacturerPartNumber: Resistor film, 100k, ±5%, 1206, 0.25W, -55...+125°C; TypeResistor: Resistor film; Power: 0.25W; Tolerance: ±5%; Package: 1206; HelpURL: https://www.digikey.com/product-detail/en/yageo/RC1206JR-07100RL/311-100ERCT-ND/732153; Temperature: -55...+125°C